# Altium project ELF 2 & ELF 2_Lite V1.3.PrjPcb (part 2 of 3)

## Sheet 06 MIPI.SchDoc
size A3; Revision: V1.2; SheetNumber: 6; SheetTotal: 11
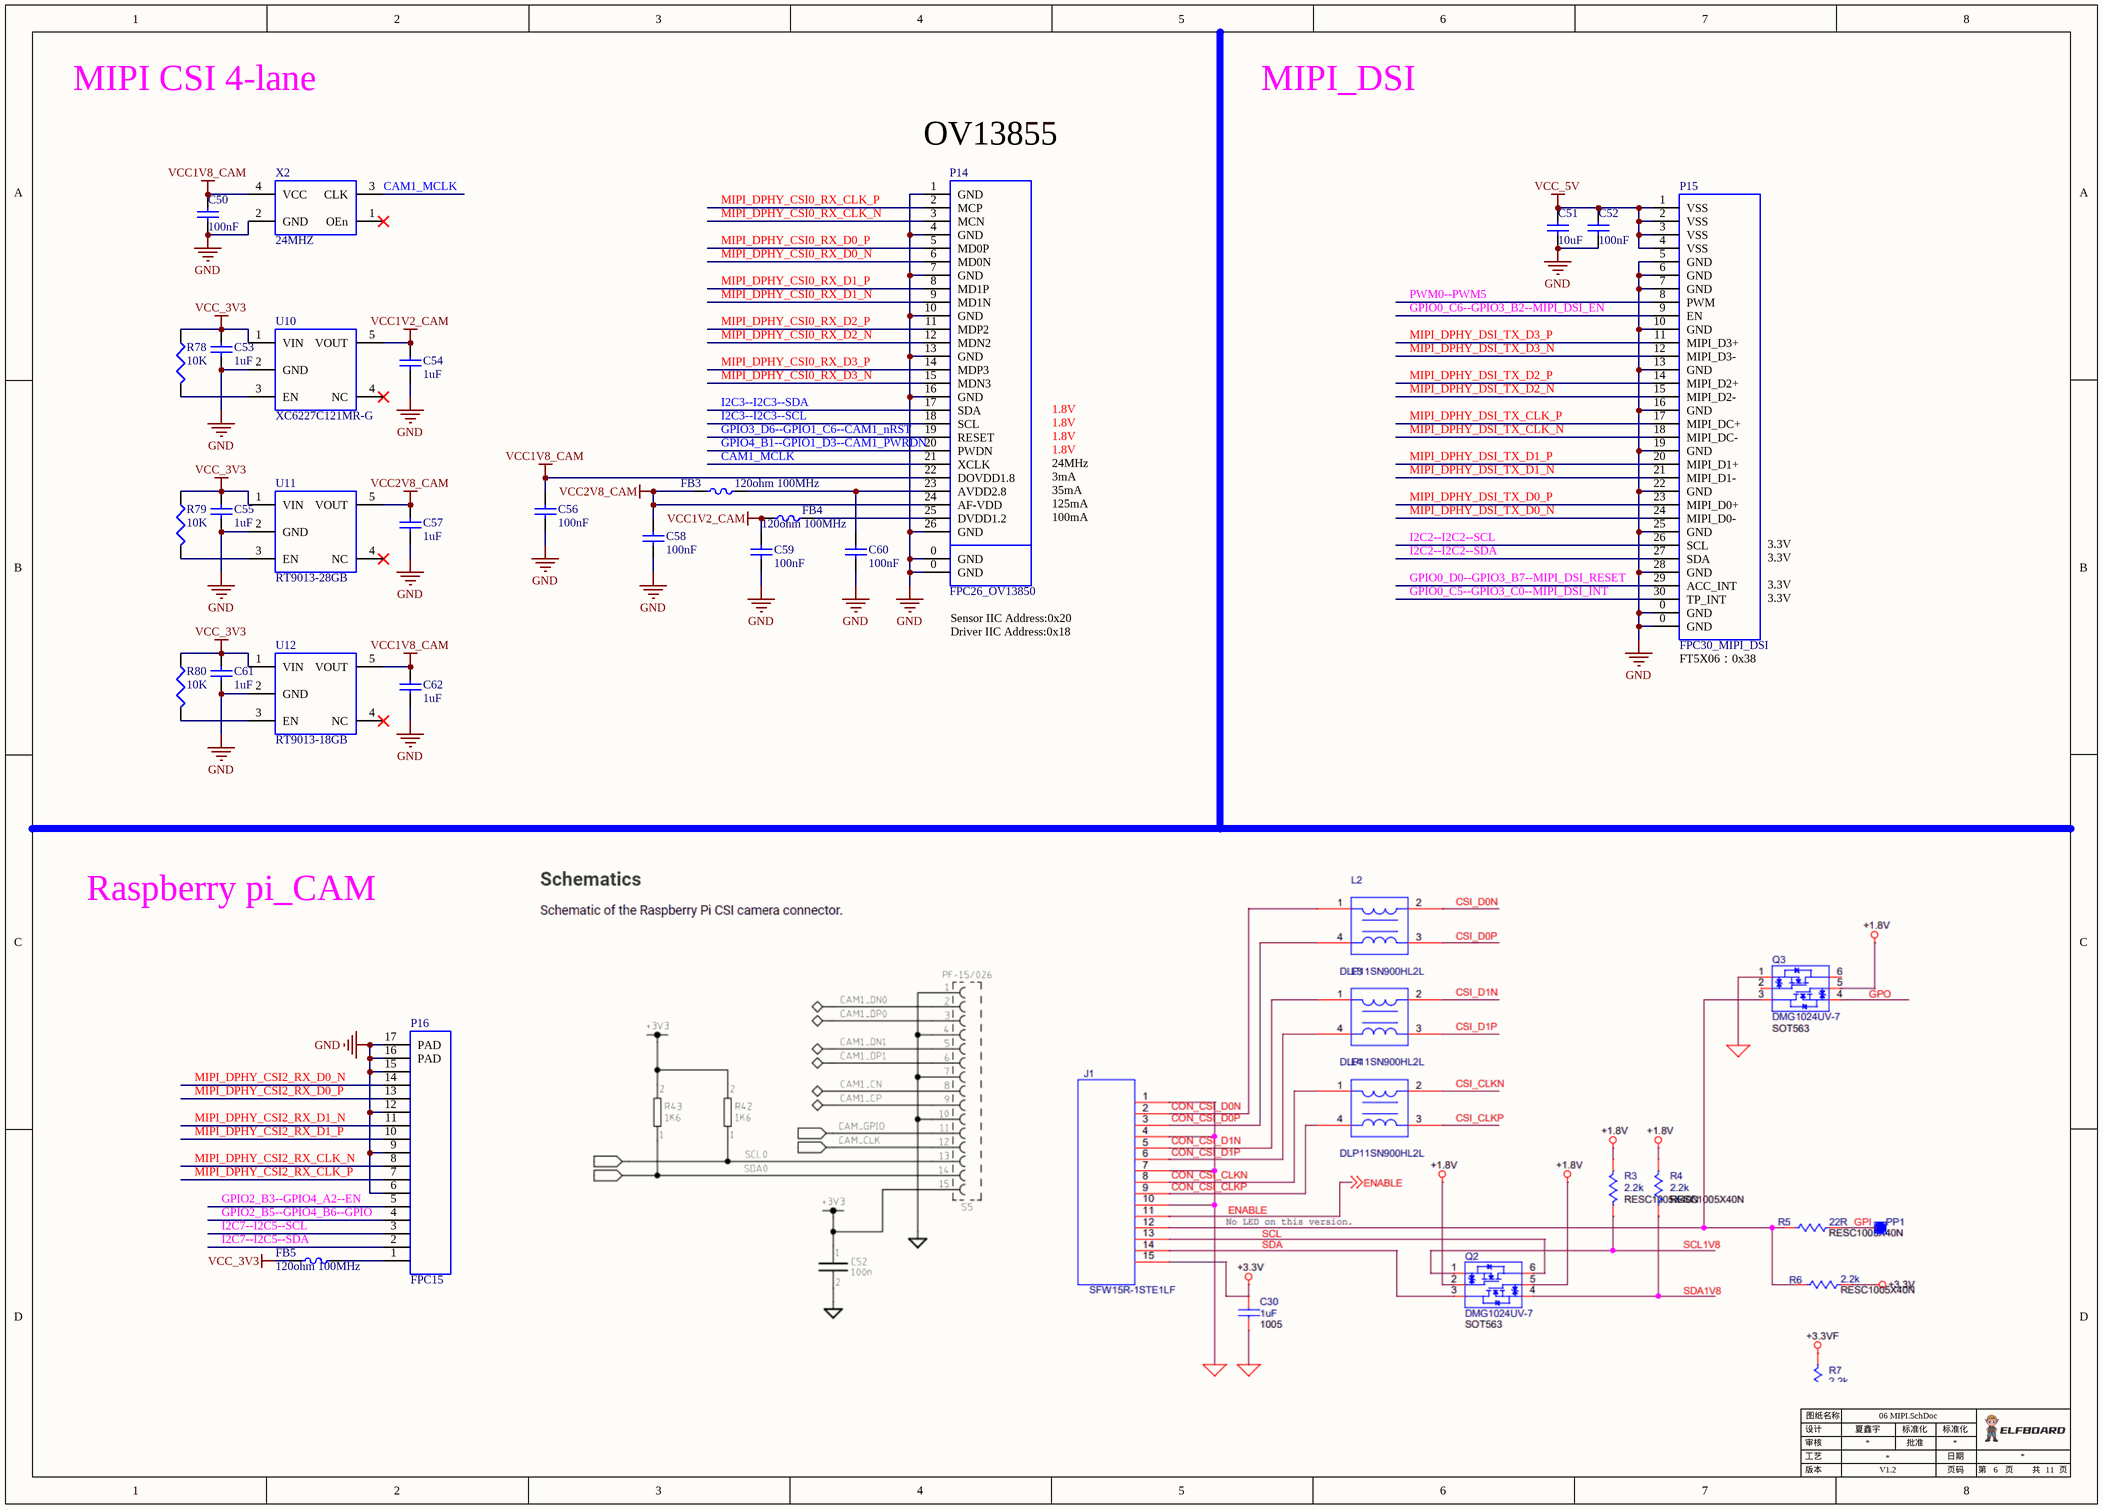
[diagram p8: 06 MIPI.SchDoc]

### Parts
C50  100nF  [0402C]
C51  10uF  [0603C]
C52  100nF  [0402C]
C53  1uF  [0402C]
C54  1uF  [0402C]
C55  1uF  [0402C]
C56  100nF  [0402C]
C57  1uF  [0402C]
C58  100nF  [0402C]
C59  100nF  [0402C]
C60  100nF  [0402C]
C61  1uF  [0402C]
C62  1uF  [0402C]
FB3  120ohm 100MHz  [0603L]
FB4  120ohm 100MHz  [0603L]
FB5  120ohm 100MHz  [0603L]
P14  FPC26_OV13850  [FPC26-a]
P15  FPC30_MIPI_DSI  [FPC30]
P16  FPC15  [FPC15-1-22_1X4_5-H5_4]
R78  10K  [0402R]
R79  10K  [0402R]
R80  10K  [0402R]
U10  XC6227C121MR-G  [SOT_235]
U11  RT9013-28GB  [SOT_235]
U12  RT9013-18GB  [SOT_235]
X2  24MHZ  [Crystals_3225]

### Nets
GND: C50.1 C51.1 C52.1 C53.1 C54.1 C55.1 C56.1 C57.1 C58.1 C59.1 C60.1 C61.1 C62.1 P14.0(GND) P14.1(GND) P14.4(GND) P14.7(GND) P14.10(GND) P14.13(GND) P14.16(GND) P14.26(GND) P15.0(GND) P15.5(GND) P15.6(GND) P15.7(GND) P15.10(GND) P15.13(GND) P15.16(GND) P15.19(GND) P15.22(GND) P15.25(GND) P15.28(GND) P16.6 P16.9 P16.12 P16.15 P16.16(PAD) P16.17(PAD) U10.2(GND) U11.2(GND) U12.2(GND) X2.2(GND)
VCC1V2_CAM: C54.2 C59.2 FB4.1 U10.5(VOUT)
VCC1V8_CAM: C50.2 C56.2 C62.2 P14.22(DOVDD1.8) U12.5(VOUT) X2.4(VCC)
VCC2V8_CAM: C57.2 C58.2 FB3.1 P14.24(AF-VDD) U11.5(VOUT)
VCC_3V3: C53.2 C55.2 C61.2 FB5.1 R78.1 R79.1 R80.1 U10.1(VIN) U11.1(VIN) U12.1(VIN)
VCC_5V: C51.2 C52.2 P15.1(VSS) P15.2(VSS) P15.3(VSS) P15.4(VSS)
CAM1_MCLK: P14.21(XCLK) X2.3(CLK)
GPIO0_C5--GPIO3_C0--MIPI_DSI_INT: P15.30(TP_INT)
GPIO0_C6--GPIO3_B2--MIPI_DSI_EN: P15.9(EN)
GPIO0_D0--GPIO3_B7--MIPI_DSI_RESET: P15.29(ACC_INT)
GPIO2_B3--GPIO4_A2--EN: P16.5
GPIO2_B5--GPIO4_B6--GPIO: P16.4
GPIO3_D6--GPIO1_C6--CAM1_nRST: P14.19(RESET)
GPIO4_B1--GPIO1_D3--CAM1_PWRDN: P14.20(PWDN)
I2C2--I2C2--SCL: P15.26(SCL)
I2C2--I2C2--SDA: P15.27(SDA)
I2C3--I2C3--SCL: P14.18(SCL)
I2C3--I2C3--SDA: P14.17(SDA)
I2C7--I2C5--SCL: P16.3
I2C7--I2C5--SDA: P16.2
MIPI_DPHY_CSI0_RX_CLK_N: P14.3(MCN)
MIPI_DPHY_CSI0_RX_CLK_P: P14.2(MCP)
MIPI_DPHY_CSI0_RX_D0_N: P14.6(MD0N)
MIPI_DPHY_CSI0_RX_D0_P: P14.5(MD0P)
MIPI_DPHY_CSI0_RX_D1_N: P14.9(MD1N)
MIPI_DPHY_CSI0_RX_D1_P: P14.8(MD1P)
MIPI_DPHY_CSI0_RX_D2_N: P14.12(MDN2)
MIPI_DPHY_CSI0_RX_D2_P: P14.11(MDP2)
MIPI_DPHY_CSI0_RX_D3_N: P14.15(MDN3)
MIPI_DPHY_CSI0_RX_D3_P: P14.14(MDP3)
MIPI_DPHY_CSI2_RX_CLK_N: P16.8
MIPI_DPHY_CSI2_RX_CLK_P: P16.7
MIPI_DPHY_CSI2_RX_D0_N: P16.14
MIPI_DPHY_CSI2_RX_D0_P: P16.13
MIPI_DPHY_CSI2_RX_D1_N: P16.11
MIPI_DPHY_CSI2_RX_D1_P: P16.10
MIPI_DPHY_DSI_TX_CLK_N: P15.18(MIPI_DC-)
MIPI_DPHY_DSI_TX_CLK_P: P15.17(MIPI_DC+)
MIPI_DPHY_DSI_TX_D0_N: P15.24(MIPI_D0-)
MIPI_DPHY_DSI_TX_D0_P: P15.23(MIPI_D0+)
MIPI_DPHY_DSI_TX_D1_N: P15.21(MIPI_D1-)
MIPI_DPHY_DSI_TX_D1_P: P15.20(MIPI_D1+)
MIPI_DPHY_DSI_TX_D2_N: P15.15(MIPI_D2-)
MIPI_DPHY_DSI_TX_D2_P: P15.14(MIPI_D2+)
MIPI_DPHY_DSI_TX_D3_N: P15.12(MIPI_D3-)
MIPI_DPHY_DSI_TX_D3_P: P15.11(MIPI_D3+)
PWM0--PWM5: P15.8(PWM)
NetC60_2: C60.2 FB3.2 P14.23(AVDD2.8)
NetFB4_2: FB4.2 P14.25(DVDD1.2)
NetFB5_2: FB5.2 P16.1
NetR78_2: R78.2 U10.3(EN)
NetR79_2: R79.2 U11.3(EN)
NetR80_2: R80.2 U12.3(EN)

Not connected (* = marked no-connect by the designer): U10 4(NC)*; U11 4(NC)*; U12 4(NC)*; X2 1(OEn)*

### Notes on the sheet
- MIPI CSI 4-lane
- MIPI_DSI
- (near P14) OV13855
- 1.8V
- 35mA
- 3mA
- 24MHz
- 125mA
- 100mA
- 3.3V
- (near P14) Sensor IIC Address:0x20
- Driver IIC Address:0x18
- (near P15) FT5X06：0x38
- Raspberry pi_CAM
- 设计
- 审核
- 工艺
- 图纸名称
- 夏鑫宇
- 批准
- 标准化
- 日期
- 版本
- 页码
- 第
- 页
- 共

### Library data of the parts
C50 C56 C58-C60 = 1110202001: as C31 on sheet 04 Debug&TF card&RTC; Published: 8-Jun-2000; LatestRevisionDate: 17-Jul-2002; LatestRevisionNote: Re-released for DXP Platform.; PackageReference: RAD-0.3; Publisher: Altium Limited; PackageDescription: Radial Cap, Thru-Hole; 2 Leads; 0.3 in Pin Spacing; Value: 100nF; 存货编码: 1110202001
C51 = 1110203037: 序号: 672; 存货名称: 贴装叠层陶瓷电容; 规格型号: 0603,10uF,10V,±20％,X5R; Published: 8-Jun-2000; LatestRevisionDate: 17-Jul-2002; LatestRevisionNote: Re-released for DXP Platform.; PackageReference: RAD-0.3; Publisher: Altium Limited; PackageDescription: Radial Cap, Thru-Hole; 2 Leads; 0.3 in Pin Spacing; Value: 10uF; 存货编码: 1110203037
C52 = 1110202039: as C11 on sheet 03 PWR; Published: 8-Jun-2000; LatestRevisionDate: 17-Jul-2002; LatestRevisionNote: Re-released for DXP Platform.; PackageReference: RAD-0.3; Publisher: Altium Limited; PackageDescription: Radial Cap, Thru-Hole; 2 Leads; 0.3 in Pin Spacing; Value: 100nF; 存货编码: 1110202039
C53-C55 C57 C61 C62 = 1110202021: as C5 on sheet 03 PWR; Published: 8-Jun-2000; LatestRevisionDate: 17-Jul-2002; LatestRevisionNote: Re-released for DXP Platform.; PackageReference: RAD-0.3; Publisher: Altium Limited; PackageDescription: Radial Cap, Thru-Hole; 2 Leads; 0.3 in Pin Spacing; Value: 1uF; 存货编码: 1110202021
FB3-FB5 = 1110304009: 序号: 998; 存货名称: 磁珠; 规格型号: 0603,120 Ohm@100MHz,2A,BLM18PG121SN1; 描述栏信息: 村田; 主计量单位名称: 只; 安全库存: 148; 旧编码: 010301062; 旧规格型号: 0603 120Ohm 100MHz 2A BLM18PG121SN1 村田; VALUE: 120ohm 100MHz; 存货编码: 1110304009
P14 = FPC26_OV13850: 010401124; 序号: 51; 存货编码: 1120103021; 存货名称: FPC座; 规格型号: 26P,0.5mm,下接翻盖; 安全库存: 1831.00; Value: FPC26_OV13850; 旧编码: 010401124
P15 = FPC30_MIPI_DSI: 010401065; 序号: 53; 存货编码: 1120103013; 存货名称: FPC座; 规格型号: 30P,0.5mm,下接翻盖; 安全库存: 390.00; Value: FPC30_MIPI_DSI; 旧编码: 010401065
P16 = 1120103051: 存货名称: FPC座; 规格型号: 15P,1.0mm,抽屉式,贴片立式; 描述: 艾诺康; 禁用: 否; Value: FPC15; 存货编码: 1120103051
R78-R80 = 1110102007: 序号: 17; 存货名称: 贴装电阻; 规格型号: 0402,10K,±5％; Value: 10K; 存货编码: 1110102007
U10 = 1110404122: 序号: 1340; 存货名称: 电源; 规格型号: XC6227C121MR-G,SOT_25; 禁用: 否; 近三年购买频次: 近三年购买频次.8; Value: XC6227C121MR-G; 存货编码: 1110404122; 最近一次购买记录: 2024/12/19; 料号建立日期: 2019/11/23
U11 = 1110404096: 序号: 2092; 存货名称: 集成电路; 安全库存: 2574; 旧编码: 010504174; 存货编码: 1110404096; 规格型号: RT9013-28GB; Value: RT9013-28GB; 旧规格型号: RT9013-28GB
U12 = 1110404097: as U1 on sheet 03 PWR; Value: RT9013-18GB; 存货编码: 1110404097
X2 = 1110601007: 序号: 3406; 存货名称: 贴装晶振; 规格型号: 有源,24MHZ,4P,3.2*2.5mm,3.3V,±20ppm; Value: 24MHZ; 存货编码: 1110601007

## Sheet 07 HDMI.SchDoc
size A3; Revision: V1.2; SheetNumber: 7; SheetTotal: 11
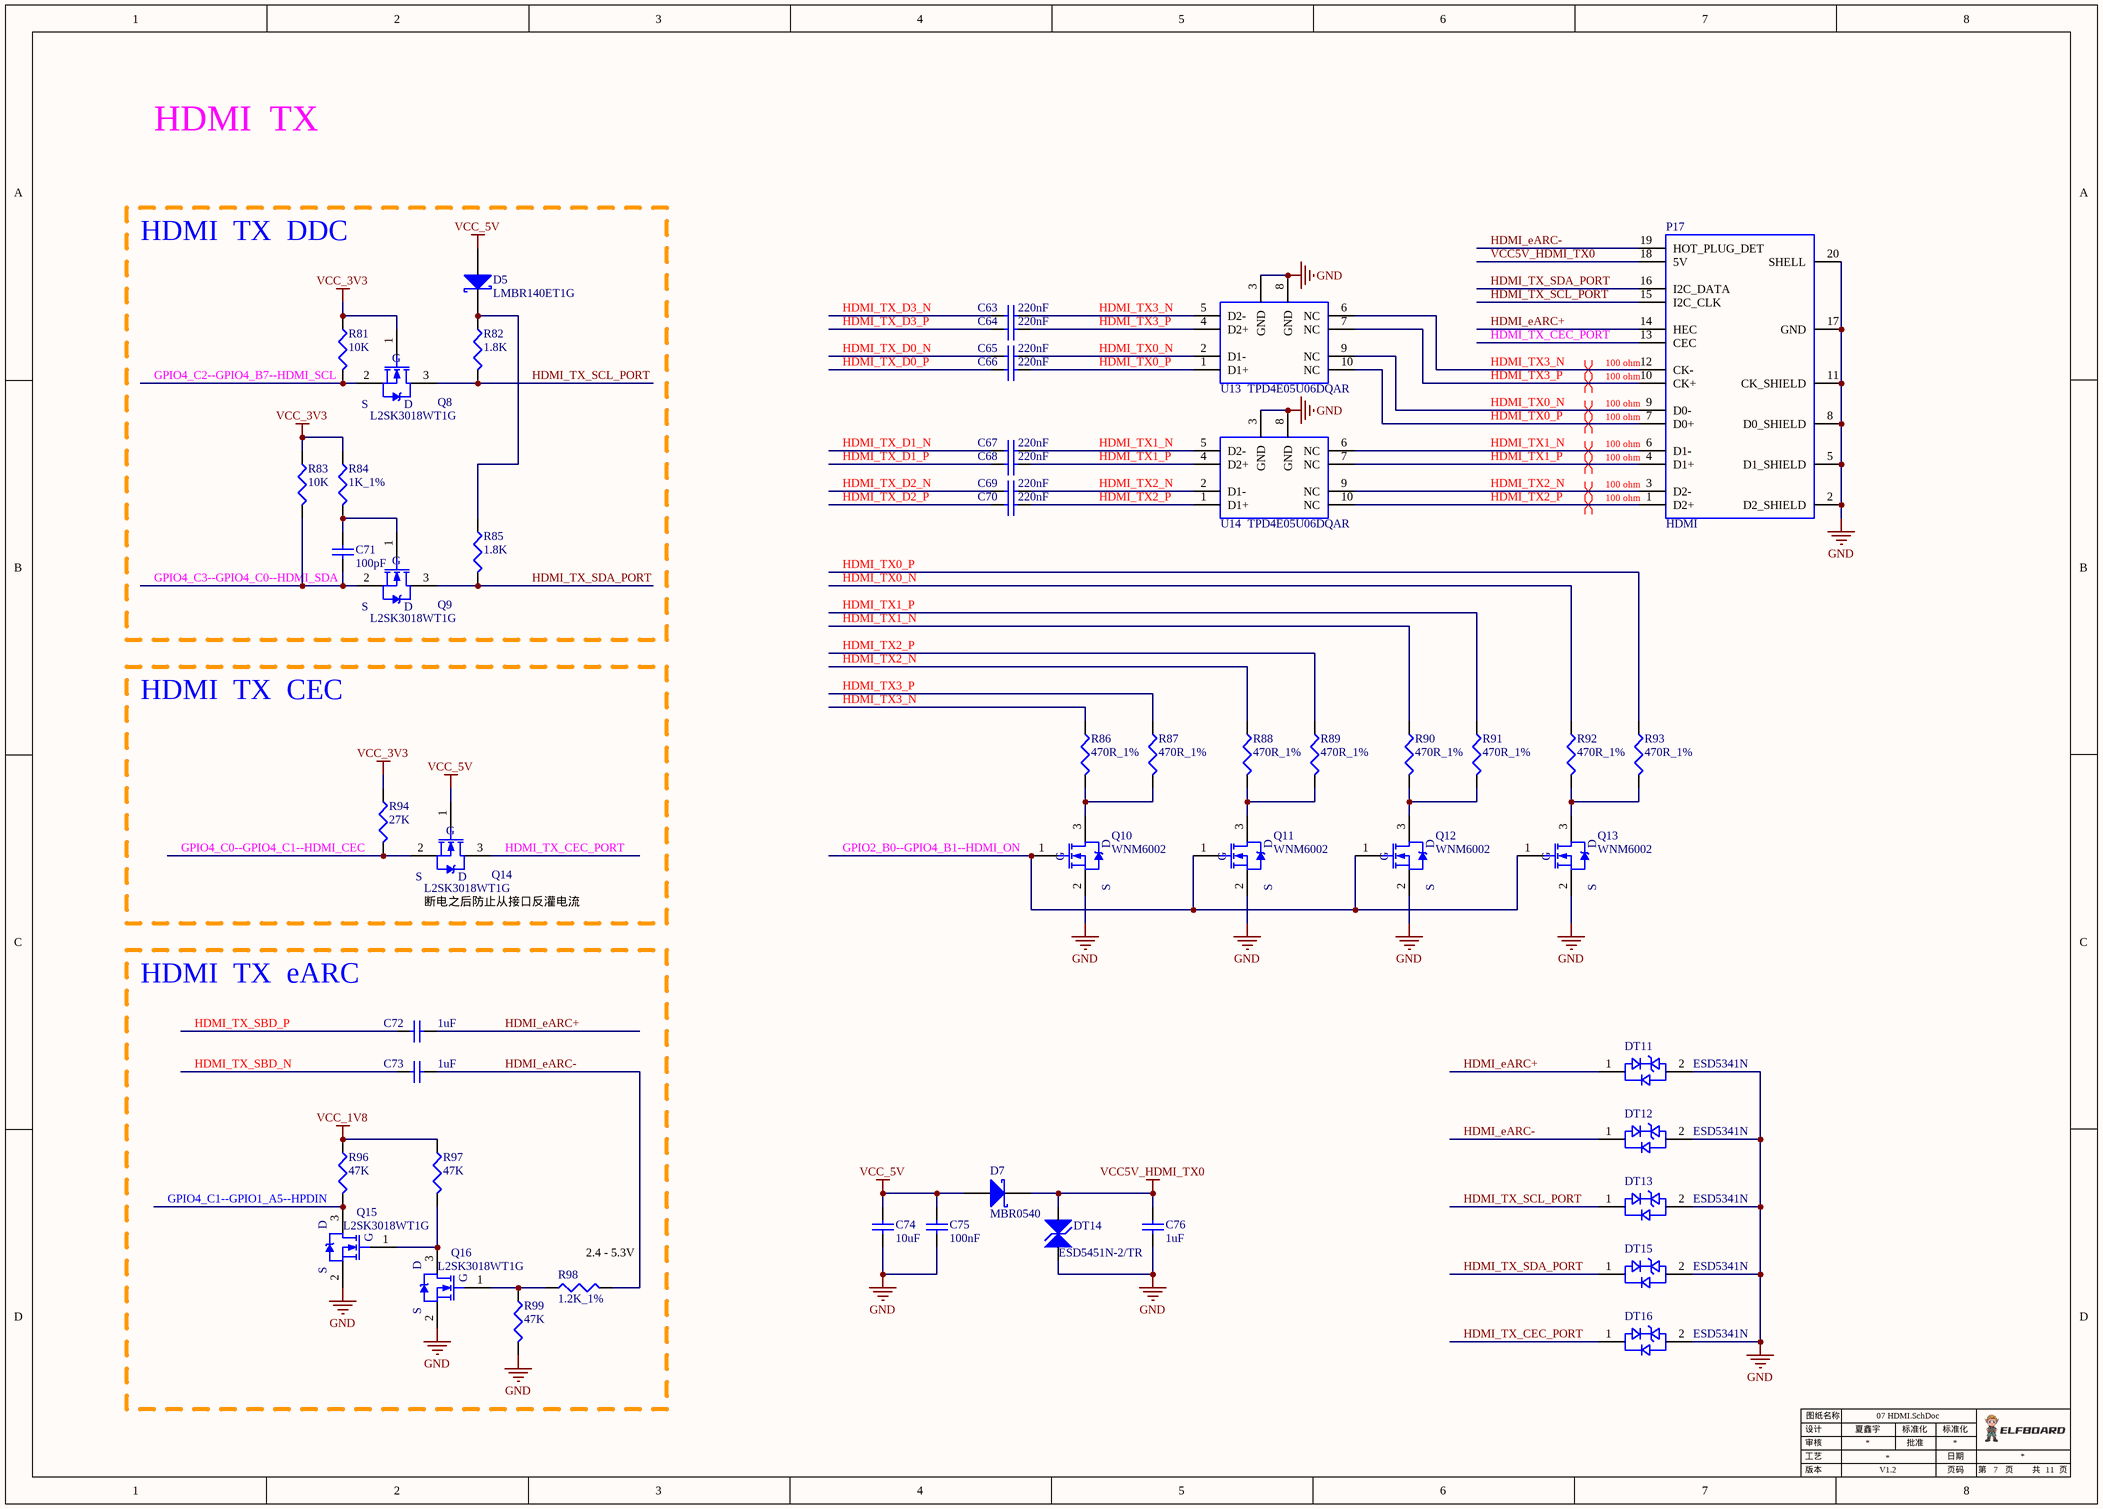
[diagram p9: 07 HDMI.SchDoc]

### Parts
C63  220nF  [0201C]
C64  220nF  [0201C]
C65  220nF  [0201C]
C66  220nF  [0201C]
C67  220nF  [0201C]
C68  220nF  [0201C]
C69  220nF  [0201C]
C70  220nF  [0201C]
C71  100pF  [0402C]
C72  1uF  [0201C]
C73  1uF  [0201C]
C74  10uF  [0603C]
C75  100nF  [0603C]
C76  1uF  [0402C]
D5  LMBR140ET1G  [SOD_323]
D7  MBR0540  [SOD_123]
DT11  ESD5341N  [0402TVS-ESD5341N]
DT12  ESD5341N  [0402TVS-ESD5341N]
DT13  ESD5341N  [0402TVS-ESD5341N]
DT14  ESD5451N-2/TR  [0402TVS]
DT15  ESD5341N  [0402TVS-ESD5341N]
DT16  ESD5341N  [0402TVS-ESD5341N]
P17  HDMI  [HDMI]
Q8  L2SK3018WT1G  [SOT323]
Q9  L2SK3018WT1G  [SOT323]
Q10  WNM6002  [SOT_323]
Q11  WNM6002  [SOT_323]
Q12  WNM6002  [SOT_323]
Q13  WNM6002  [SOT_323]
Q14  L2SK3018WT1G  [SOT323]
Q15  L2SK3018WT1G  [SOT323]
Q16  L2SK3018WT1G  [SOT323]
R81  10K  [0402R]
R82  1.8K  [0402R]
R83  10K  [0402R]
R84  1K_1%  [0402R]
R85  1.8K  [0402R]
R86  470R_1%  [0201R]
R87  470R_1%  [0201R]
R88  470R_1%  [0201R]
R89  470R_1%  [0201R]
R90  470R_1%  [0201R]
R91  470R_1%  [0201R]
R92  470R_1%  [0201R]
R93  470R_1%  [0201R]
R94  27K  [0402R]
R96  47K  [0402R]
R97  47K  [0402R]
R98  1.2K_1%  [0402R]
R99  47K  [0402R]
U13  TPD4E05U06DQAR  [USON-10]
U14  TPD4E05U06DQAR  [USON-10]

### Nets
GND: C74.1 C75.1 C76.1 DT11.2 DT12.2 DT13.2 DT14.1 DT15.2 DT16.2 P17.2(D2_SHIELD) P17.5(D1_SHIELD) P17.8(D0_SHIELD) P17.11(CK_SHIELD) P17.17(GND) P17.20(SHELL) Q10.2(S) Q11.2(S) Q12.2(S) Q13.2(S) Q15.2(S) Q16.2(S) R99.2 U13.3(GND) U13.8(GND) U14.3(GND) U14.8(GND)
VCC5V_HDMI_TX0: C76.2 D7.2(K) DT14.2 P17.18(5V)
VCC_1V8: R96.1 R97.1
VCC_3V3: Q8.1(G) R81.1 R83.1 R84.1 R94.1
VCC_5V: C74.2 C75.2 D5.1(A) D7.1(A) Q14.1(G)
GPIO2_B0--GPIO4_B1--HDMI_ON: Q10.1(G) Q11.1(G) Q12.1(G) Q13.1(G)
GPIO4_C0--GPIO4_C1--HDMI_CEC: Q14.2(S) R94.2
GPIO4_C1--GPIO1_A5--HPDIN: Q15.3(D) R96.2
GPIO4_C2--GPIO4_B7--HDMI_SCL: Q8.2(S) R81.2
GPIO4_C3--GPIO4_C0--HDMI_SDA: C71.1 Q9.2(S) R83.2
HDMI_eARC+: C72.2 DT11.1 P17.14(HEC)
HDMI_eARC-: C73.2 DT12.1 P17.19(HOT_PLUG_DET) R98.2
HDMI_TX0_N: C65.2 P17.9(D0-) R92.1 U13.2(D1-) U13.9(NC)
HDMI_TX0_P: C66.2 P17.7(D0+) R93.1 U13.1(D1+) U13.10(NC)
HDMI_TX1_N: C67.2 P17.6(D1-) R90.1 U14.5(D2-) U14.6(NC)
HDMI_TX1_P: C68.2 P17.4(D1+) R91.1 U14.4(D2+) U14.7(NC)
HDMI_TX2_N: C69.2 P17.3(D2-) R88.1 U14.2(D1-) U14.9(NC)
HDMI_TX2_P: C70.2 P17.1(D2+) R89.1 U14.1(D1+) U14.10(NC)
HDMI_TX3_N: C63.2 P17.12(CK-) R86.1 U13.5(D2-) U13.6(NC)
HDMI_TX3_P: C64.2 P17.10(CK+) R87.1 U13.4(D2+) U13.7(NC)
HDMI_TX_CEC_PORT: DT16.1 P17.13(CEC) Q14.3(D)
HDMI_TX_D0_N: C65.1
HDMI_TX_D0_P: C66.1
HDMI_TX_D1_N: C67.1
HDMI_TX_D1_P: C68.1
HDMI_TX_D2_N: C69.1
HDMI_TX_D2_P: C70.1
HDMI_TX_D3_N: C63.1
HDMI_TX_D3_P: C64.1
HDMI_TX_SBD_N: C73.1
HDMI_TX_SBD_P: C72.1
HDMI_TX_SCL_PORT: DT13.1 P17.15(I2C_CLK) Q8.3(D) R82.2
HDMI_TX_SDA_PORT: DT15.1 P17.16(I2C_DATA) Q9.3(D) R85.2
NetC71_2: C71.2 Q9.1(G) R84.2
NetD5_2: D5.2(K) R82.1 R85.1
NetQ10_3: Q10.3(D) R86.2 R87.2
NetQ11_3: Q11.3(D) R88.2 R89.2
NetQ12_3: Q12.3(D) R90.2 R91.2
NetQ13_3: Q13.3(D) R92.2 R93.2
NetQ15_1: Q15.1(G) Q16.3(D) R97.2
NetQ16_1: Q16.1(G) R98.1 R99.1

### Layout directives
differential pair; differential pair class 100 ohm: HDMI_TX0_N, HDMI_TX0_P, HDMI_TX1_N, HDMI_TX1_P, HDMI_TX2_N, HDMI_TX2_P, HDMI_TX3_N, HDMI_TX3_P

### Notes on the sheet
- HDMI  TX
- HDMI  TX  DDC
- HDMI  TX  CEC
- (near Q14) 断电之后防止从接口反灌电流
- HDMI  TX  eARC
- (near R98) 2.4 - 5.3V
- 设计
- 审核
- 工艺
- 图纸名称
- 夏鑫宇
- 批准
- 标准化
- 日期
- 版本
- 页码
- 第
- 页
- 共

### Library data of the parts
C63-C70 = 1110201001: 序号: 928; 存货名称: 贴装叠层陶瓷电容; 规格型号: 0201,220nF,6.3V,±20％,X5R; Published: 8-Jun-2000; LatestRevisionDate: 17-Jul-2002; LatestRevisionNote: Re-released for DXP Platform.; PackageReference: RAD-0.3; Publisher: Altium Limited; PackageDescription: Radial Cap, Thru-Hole; 2 Leads; 0.3 in Pin Spacing; Value: 220nF; 存货编码: 1110201001
C71 = 1110202016: 序号: 587; 存货名称: 贴装叠层陶瓷电容; 规格型号: 0402,100pF,50V,±5％,NPO; Published: 8-Jun-2000; LatestRevisionDate: 17-Jul-2002; LatestRevisionNote: Re-released for DXP Platform.; PackageReference: RAD-0.3; Publisher: Altium Limited; PackageDescription: Radial Cap, Thru-Hole; 2 Leads; 0.3 in Pin Spacing; Value: 100pF; 存货编码: 1110202016
C72 C73 = 1110201015: 存货名称: 贴装叠层陶瓷电容; 规格型号: 0201,1uF,10V,±20％,X5R; Published: 8-Jun-2000; LatestRevisionDate: 17-Jul-2002; LatestRevisionNote: Re-released for DXP Platform.; PackageReference: RAD-0.3; Publisher: Altium Limited; PackageDescription: Radial Cap, Thru-Hole; 2 Leads; 0.3 in Pin Spacing; Value: 1uF; 存货编码: 1110201015
C74 = 1110203058: 序号: 707; 存货名称: 贴装叠层陶瓷电容; 规格型号: 0603,10uF,10V,±10％,X5R; 禁用状态: 否; Published: 8-Jun-2000; LatestRevisionDate: 17-Jul-2002; LatestRevisionNote: Re-released for DXP Platform.; PackageReference: RAD-0.3; Publisher: Altium Limited; PackageDescription: Radial Cap, Thru-Hole; 2 Leads; 0.3 in Pin Spacing; Value: 10uF; 存货编码: 1110203058
C75 = 1110203001: 序号: 628; 存货名称: 贴装叠层陶瓷电容; 规格型号: 0603,100nF,50V,±10％,X7R; 禁用状态: 否; Published: 8-Jun-2000; LatestRevisionDate: 17-Jul-2002; LatestRevisionNote: Re-released for DXP Platform.; PackageReference: RAD-0.3; Publisher: Altium Limited; PackageDescription: Radial Cap, Thru-Hole; 2 Leads; 0.3 in Pin Spacing; Value: 100nF; 存货编码: 1110203001
C76 = 1110202021: as C5 on sheet 03 PWR; Published: 8-Jun-2000; LatestRevisionDate: 17-Jul-2002; LatestRevisionNote: Re-released for DXP Platform.; PackageReference: RAD-0.3; Publisher: Altium Limited; PackageDescription: Radial Cap, Thru-Hole; 2 Leads; 0.3 in Pin Spacing; Value: 1uF; 存货编码: 1110202021
D5 = 1110501064: 存货名称: 肖特基二极管; 规格型号: LMBR140ET1G,SOD323; Published: 8-Jun-2000; LatestRevisionDate: 17-Jul-2002; LatestRevisionNote: Re-released for DXP Platform.; PackageReference: SMB; Publisher: Altium Limited; PackageDescription: DO-214-AA/SMB; 2 C-Bend Leads; Body 5.3 x 3.6 mm, inc. leads (LxW); Code_JEDEC: DO-214-AA; 存货编码: 1110501064; Value: LMBR140ET1G
D7 = 1110501001: 序号: 2480; 存货名称: 肖特基二极管; 规格型号: MBR0540,SOD123; Published: 8-Jun-2000; LatestRevisionDate: 17-Jul-2002; LatestRevisionNote: Re-released for DXP Platform.; PackageReference: SMB; Publisher: Altium Limited; PackageDescription: DO-214-AA/SMB; 2 C-Bend Leads; Body 5.3 x 3.6 mm, inc. leads (LxW); Code_JEDEC: DO-214-AA; 存货编码: 1110501001; Value: MBR0540
DT11-DT13 DT15 DT16 = 1110503052: 序号: 4824; 存货名称: TVS管; 规格型号: ESD5341N-2/TR,0402TVS; value: ESD5341N-2/TR; 禁用状态: 否; 存货编码: 1110503052
DT14 = 1110503036: 存货名称: TVS管; 规格型号: ESD5451N-2/TR,DFN1006-2L; 禁用状态: 否; Value: ESD5451N-2/TR; 存货编码: 1110503036
P17 = 1120202041: 序号: 2494; 存货名称: 插装HDMI座; 规格型号: A型; 描述: FCI生产编号:10029449,001RLF,与1120202030通用; 禁用状态: 否; 存货编码: 1120202041; value: HDMI
Q8 Q9 Q14-Q16 = 1110505029: Note: Pin 2 is electrically connected to pin 4.; 序号: 4061; 存货名称: 场效应管; 规格型号: L2SK3018WT1G,SOT-323; 描述: 替代1110505016; 禁用状态: 否; Published: 8-Jun-2000; LatestRevisionDate: 17-Jul-2002; LatestRevisionNote: Re-released for DXP Platform.; DatasheetVersion: PD-9.814; PackageVersion: Feb-1997; PackageReference: TO-220AB; Publisher: Altium Limited; PackageDescription: TO, Thru-Hole, Vertical, Heatsink Mounted; 3 In-Line Leads; Pitch 2.54 mm; VALUE: L2SK3018WT1G; 存货编码: 1110505029
Q10-Q13 = 1110505033: Note: Pin 2 is electrically connected to pin 4.; 序号: 4825; 存货名称: 场效应管; 规格型号: WNM6002,SOT_323,N沟道; 禁用状态: 否; Published: 8-Jun-2000; LatestRevisionDate: 17-Jul-2002; LatestRevisionNote: Re-released for DXP Platform.; DatasheetVersion: PD-9.814; PackageVersion: Feb-1997; PackageReference: TO-220AB; Publisher: Altium Limited; PackageDescription: TO, Thru-Hole, Vertical, Heatsink Mounted; 3 In-Line Leads; Pitch 2.54 mm; VALUE: WNM6002; 存货编码: 1110505033
R81 R83 = 1110102007: 序号: 17; 存货名称: 贴装电阻; 规格型号: 0402,10K,±5％; Value: 10K; 存货编码: 1110102007
R82 R85 = 1110102185: 存货名称: 贴装电阻; 规格型号: 0402,1.8K,±5％; 描述栏信息: 厚声; Value: 1.8K; 存货编码: 1110102185
R84 = 1110102011: 序号: 21; 存货名称: 贴装电阻; 规格型号: 0402,1K,±1％; Value: 1K_1%; 存货编码: 1110102011
R86-R93 = 1110101007: 存货名称: 贴装电阻; 规格型号: 0201,470Ω,±1％; Value: 470R_1%; 存货编码: 1110101007
R94 = 1110102085: 序号: 119; 存货名称: 贴装电阻; 规格型号: 0402,27K,±5％; Value: 27K; 存货编码: 1110102085
R96 R97 R99 = 1110102040: 序号: 53; 存货名称: 贴装电阻; 规格型号: 0402,47K,±5％; Value: 47K; 存货编码: 1110102040
R98 = 1110102012: 序号: 22; 存货名称: 贴装电阻; 规格型号: 0402,1.2K,±1％; Value: 1.2K_1%; 存货编码: 1110102012
U13 U14 = 1110503037: 存货名称: TVS管; 规格型号: TPD4E05U06DQAR,USON; Value: TPD4E05U06DQAR; 存货编码: 1110503037

## Sheet 08 TypeC USB DP.SchDoc
size A3; Revision: V1.2; SheetNumber: 8; SheetTotal: 11
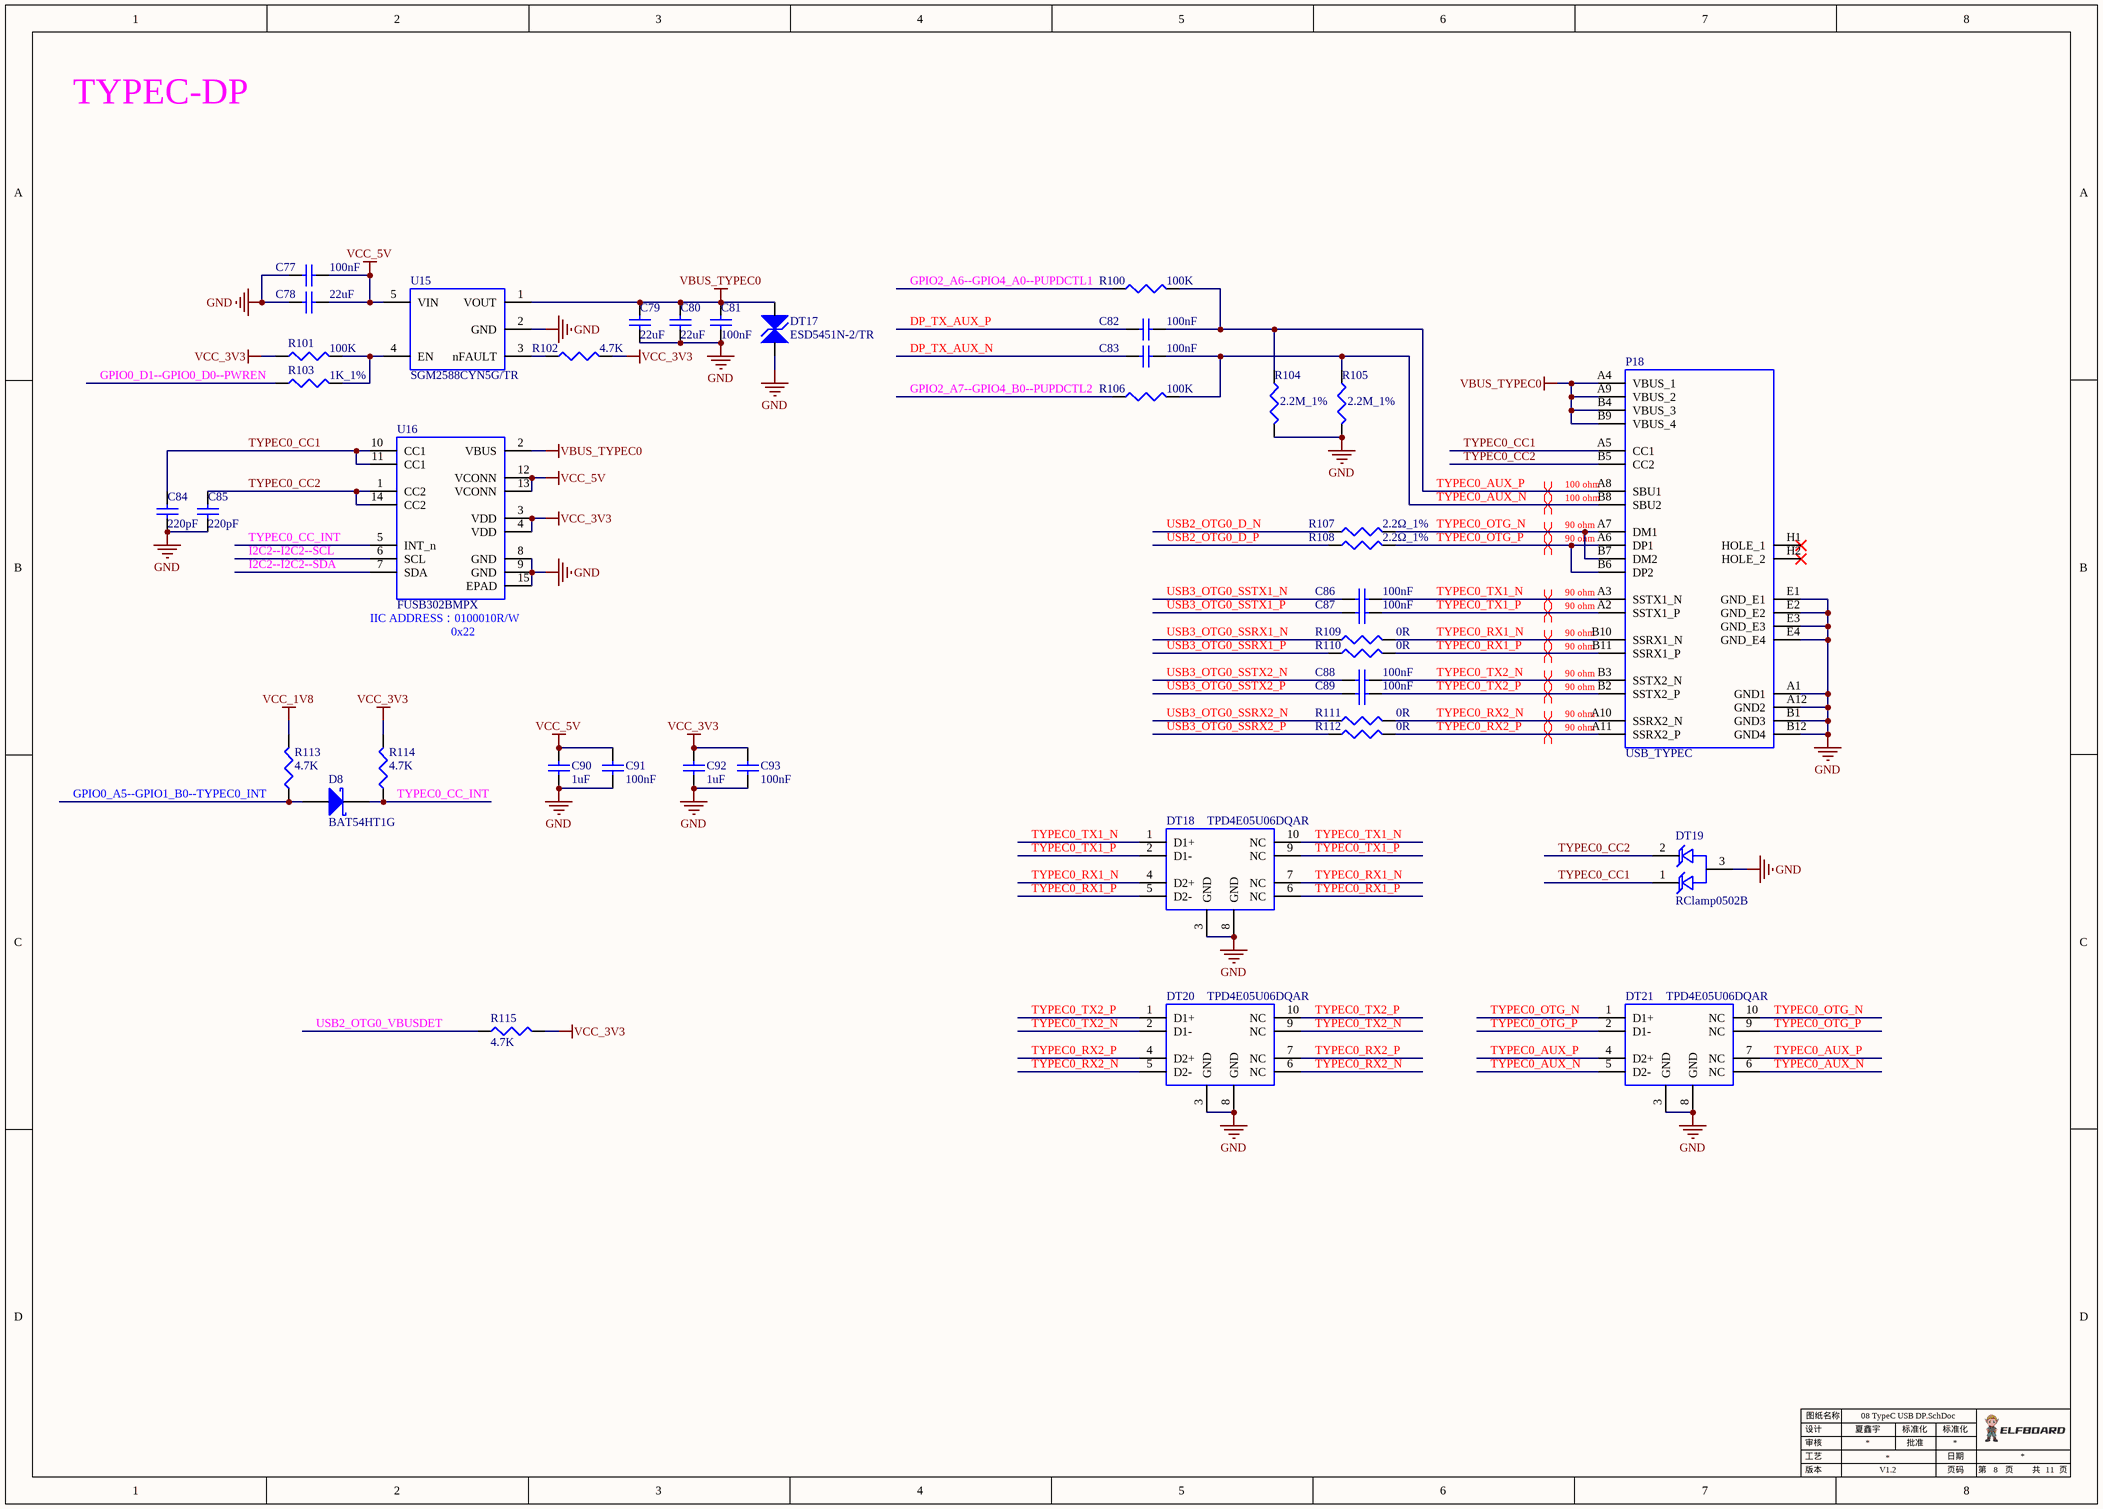
[diagram p10: 08 TypeC USB DP.SchDoc]

### Parts
C77  100nF  [0402C]
C78  22uF  [0805C]
C79  22uF  [0805C]
C80  22uF  [0805C]
C81  100nF  [0402C]
C82  100nF  [0201C]
C83  100nF  [0201C]
C84  220pF  [0402C]
C85  220pF  [0402C]
C86  100nF  [0201C]
C87  100nF  [0201C]
C88  100nF  [0201C]
C89  100nF  [0201C]
C90  1uF  [0402C]
C91  100nF  [0402C]
C92  1uF  [0402C]
C93  100nF  [0402C]
D8  BAT54HT1G  [SOD_323]
DT17  ESD5451N-2/TR  [0402TVS]
DT18  TPD4E05U06DQAR  [USON-10]
DT19  RClamp0502B  [SOT_523]
DT20  TPD4E05U06DQAR  [USON-10]
DT21  TPD4E05U06DQAR  [USON-10]
P18  USB_TYPEC  [USB_TYPEC_SMT]
R100  100K  [0402R]
R101  100K  [0402R]
R102  4.7K  [0402R]
R103  1K_1%  [0402R]
R104  2.2M_1%  [0201R]
R105  2.2M_1%  [0201R]
R106  100K  [0402R]
R107  2.2Ω_1%  [0402R]
R108  2.2Ω_1%  [0402R]
R109  0R  [0201R]
R110  0R  [0201R]
R111  0R  [0201R]
R112  0R  [0201R]
R113  4.7K  [0402R]
R114  4.7K  [0402R]
R115  4.7K  [0402R]
U15  SGM2588CYN5G/TR  [SOT_235]
U16  FUSB302BMPX  [WQFN14_0.5_2.5x2.5]

### Nets
GND: C77.2 C78.2 C79.1 C80.1 C81.1 C84.2 C85.2 C90.1 C91.1 C92.1 C93.1 DT17.1 DT18.3(GND) DT18.8(GND) DT19.3 DT20.3(GND) DT20.8(GND) DT21.3(GND) DT21.8(GND) P18.A1(GND1) P18.A12(GND2) P18.B1(GND3) P18.B12(GND4) P18.E1(GND_E1) P18.E2(GND_E2) P18.E3(GND_E3) P18.E4(GND_E4) R104.2 R105.2 U15.2(GND) U16.8(GND) U16.9(GND) U16.15(EPAD)
VBUS_TYPEC0: C79.2 C80.2 C81.2 DT17.2 P18.A4(VBUS_1) P18.A9(VBUS_2) P18.B4(VBUS_3) P18.B9(VBUS_4) U15.1(VOUT) U16.2(VBUS)
VCC_1V8: R113.2
VCC_3V3: C92.2 C93.2 R101.1 R102.2 R114.2 R115.2 U16.3(VDD) U16.4(VDD)
VCC_5V: C77.1 C78.1 C90.2 C91.2 U15.5(VIN) U16.12(VCONN) U16.13(VCONN)
DP_TX_AUX_N: C83.1
DP_TX_AUX_P: C82.1
GPIO0_A5--GPIO1_B0--TYPEC0_INT: D8.1(A) R113.1
GPIO0_D1--GPIO0_D0--PWREN: R103.1
GPIO2_A6--GPIO4_A0--PUPDCTL1: R100.1
GPIO2_A7--GPIO4_B0--PUPDCTL2: R106.1
I2C2--I2C2--SCL: U16.6(SCL)
I2C2--I2C2--SDA: U16.7(SDA)
TYPEC0_AUX_N: C83.2 DT21.5(D2-) DT21.6(NC) P18.B8(SBU2) R105.1 R106.2
TYPEC0_AUX_P: C82.2 DT21.4(D2+) DT21.7(NC) P18.A8(SBU1) R100.2 R104.1
TYPEC0_CC1: C84.1 DT19.1 P18.A5(CC1) U16.10(CC1) U16.11(CC1)
TYPEC0_CC2: C85.1 DT19.2 P18.B5(CC2) U16.1(CC2) U16.14(CC2)
TYPEC0_CC_INT: D8.2(K) R114.1 U16.5(INT_n)
TYPEC0_OTG_N: DT21.1(D1+) DT21.10(NC) P18.A7(DM1) P18.B7(DM2) R107.2
TYPEC0_OTG_P: DT21.2(D1-) DT21.9(NC) P18.A6(DP1) P18.B6(DP2) R108.2
TYPEC0_RX1_N: DT18.4(D2+) DT18.7(NC) P18.B10(SSRX1_N) R109.2
TYPEC0_RX1_P: DT18.5(D2-) DT18.6(NC) P18.B11(SSRX1_P) R110.2
TYPEC0_RX2_N: DT20.5(D2-) DT20.6(NC) P18.A10(SSRX2_N) R111.2
TYPEC0_RX2_P: DT20.4(D2+) DT20.7(NC) P18.A11(SSRX2_P) R112.2
TYPEC0_TX1_N: C86.2 DT18.1(D1+) DT18.10(NC) P18.A3(SSTX1_N)
TYPEC0_TX1_P: C87.2 DT18.2(D1-) DT18.9(NC) P18.A2(SSTX1_P)
TYPEC0_TX2_N: C88.2 DT20.2(D1-) DT20.9(NC) P18.B3(SSTX2_N)
TYPEC0_TX2_P: C89.2 DT20.1(D1+) DT20.10(NC) P18.B2(SSTX2_P)
USB2_OTG0_D_N: R107.1
USB2_OTG0_D_P: R108.1
USB2_OTG0_VBUSDET: R115.1
USB3_OTG0_SSRX1_N: R109.1
USB3_OTG0_SSRX1_P: R110.1
USB3_OTG0_SSRX2_N: R111.1
USB3_OTG0_SSRX2_P: R112.1
USB3_OTG0_SSTX1_N: C86.1
USB3_OTG0_SSTX1_P: C87.1
USB3_OTG0_SSTX2_N: C88.1
USB3_OTG0_SSTX2_P: C89.1
NetR101_2: R101.2 R103.2 U15.4(EN)
NetR102_1: R102.1 U15.3(nFAULT)

Not connected (* = marked no-connect by the designer): P18 H1(HOLE_1)* H2(HOLE_2)*

### Layout directives
differential pair; differential pair class 90 ohm: TYPEC0_OTG_N, TYPEC0_OTG_P, TYPEC0_RX1_N, TYPEC0_RX1_P, TYPEC0_RX2_N, TYPEC0_RX2_P, TYPEC0_TX1_N, TYPEC0_TX1_P, TYPEC0_TX2_N, TYPEC0_TX2_P
differential pair; differential pair class 100 ohm: TYPEC0_AUX_N, TYPEC0_AUX_P

### Notes on the sheet
- TYPEC-DP
- (near U16) IIC ADDRESS：0100010R/W
- (near U16) 0x22
- 设计
- 审核
- 工艺
- 图纸名称
- 夏鑫宇
- 批准
- 标准化
- 日期
- 版本
- 页码
- 第
- 页
- 共

### Library data of the parts
C77 C81 C91 C93 = 1110202039: as C11 on sheet 03 PWR; Published: 8-Jun-2000; LatestRevisionDate: 17-Jul-2002; LatestRevisionNote: Re-released for DXP Platform.; PackageReference: RAD-0.3; Publisher: Altium Limited; PackageDescription: Radial Cap, Thru-Hole; 2 Leads; 0.3 in Pin Spacing; Value: 100nF; 存货编码: 1110202039
C78-C80 = 1110204014: 序号: 751; 存货名称: 贴装叠层陶瓷电容; 规格型号: 0805,22uF,25V,±20％,X5R; Published: 8-Jun-2000; LatestRevisionDate: 17-Jul-2002; LatestRevisionNote: Re-released for DXP Platform.; PackageReference: RAD-0.3; Publisher: Altium Limited; PackageDescription: Radial Cap, Thru-Hole; 2 Leads; 0.3 in Pin Spacing; Value: 22uF; 存货编码: 1110204014
C82 C83 C86-C89 = 1110201009: 存货名称: 贴装叠层陶瓷电容; 规格型号: 0201,100nF,25V,±10％,X5R; Published: 8-Jun-2000; LatestRevisionDate: 17-Jul-2002; LatestRevisionNote: Re-released for DXP Platform.; PackageReference: RAD-0.3; Publisher: Altium Limited; PackageDescription: Radial Cap, Thru-Hole; 2 Leads; 0.3 in Pin Spacing; Value: 100nF; 存货编码: 1110201009
C84 C85 = 1110202017: 序号: 588; 存货名称: 贴装叠层陶瓷电容; 规格型号: 0402,220pF,50V,±10％,X7R; Published: 8-Jun-2000; LatestRevisionDate: 17-Jul-2002; LatestRevisionNote: Re-released for DXP Platform.; PackageReference: RAD-0.3; Publisher: Altium Limited; PackageDescription: Radial Cap, Thru-Hole; 2 Leads; 0.3 in Pin Spacing; Value: 220pF; 存货编码: 1110202017
C90 C92 = 1110202021: as C5 on sheet 03 PWR; Published: 8-Jun-2000; LatestRevisionDate: 17-Jul-2002; LatestRevisionNote: Re-released for DXP Platform.; PackageReference: RAD-0.3; Publisher: Altium Limited; PackageDescription: Radial Cap, Thru-Hole; 2 Leads; 0.3 in Pin Spacing; Value: 1uF; 存货编码: 1110202021
D8 = 1110501028: 序号: 2525; 存货名称: 肖特基二极管; 规格型号: BAT54HT1G,SOD323; Published: 8-Jun-2000; LatestRevisionDate: 17-Jul-2002; LatestRevisionNote: Re-released for DXP Platform.; PackageReference: SMB; Publisher: Altium Limited; PackageDescription: DO-214-AA/SMB; 2 C-Bend Leads; Body 5.3 x 3.6 mm, inc. leads (LxW); Code_JEDEC: DO-214-AA; 存货编码: 1110501028; Value: BAT54HT1G
DT17 = 1110503036: as DT14 on sheet 07 HDMI; Value: ESD5451N-2/TR; 存货编码: 1110503036
DT18 DT20 DT21 = 1110503037: 存货名称: TVS管; 规格型号: TPD4E05U06DQAR,USON; Value: TPD4E05U06DQAR; 存货编码: 1110503037
DT19 = 1110503016: 序号: 2598; 存货名称: TVS管; 规格型号: RCLAMP0502B,SOT-523; Value: RClamp0502B; 存货编码: 1110503016
P18 = 1120102089: 存货名称: 贴装USB座; 规格型号: USB3.0,Type-C,母座,单层,横卧,脚长2mm,雾面,-25~+80℃ TYPEC-507DSW-ACP24F; Value: TYPEC-507DSW-ACP24F; 存货编码: 1120102089
R100 R101 R106 = 1110102004: 序号: 14; 存货名称: 贴装电阻; 规格型号: 0402,100K,±5％; Value: 100K; 存货编码: 1110102004
R102 R113-R115 = 1110102003: 序号: 12; 存货名称: 贴装电阻; 规格型号: 0402,4.7K,±5％; Value: 4.7K; 存货编码: 1110102003
R103 = 1110102011: 序号: 21; 存货名称: 贴装电阻; 规格型号: 0402,1K,±1％; Value: 1K_1%; 存货编码: 1110102011
R104 R105 = 1110101020: 存货名称: 贴装电阻; 规格型号: 0201,2.2M,±1％; Value: 2.2M_1%; 存货编码: 1110101020
R107 R108 = 1110102176: 序号: 196; 存货名称: 贴装电阻; 规格型号: 0402,2.2Ω,±1％; 禁用状态: 否; Value: 2.2Ω_1%; 存货编码: 1110102176
R109-R112 = 1110101001: 序号: 556; 存货名称: 贴装电阻; 规格型号: 0201,0Ω,±5%; Value: 0R; 存货编码: 1110101001
U15 = 1110404183: 序号: 4794; 存货名称: 电源; 规格型号: SGM2588CYN5G/TR,SOT-23-5; 禁用: 否; 近三年购买频次: 近三年购买频次.19; Value: SGM2588CYN5G/TR; 存货编码: 1110404183; 最近一次购买记录: 2025/2/8; 料号建立日期: 2022/10/14
U16 = 1110405272: 存货名称: 常规IC; 规格型号: FUSB302BMPX,WQFN-14; Value: FUSB302BMPX; 存货编码: 1110405272

## Sheet 09 Audio.SchDoc
size A4; Revision: V1.2; SheetNumber: 9; SheetTotal: 11
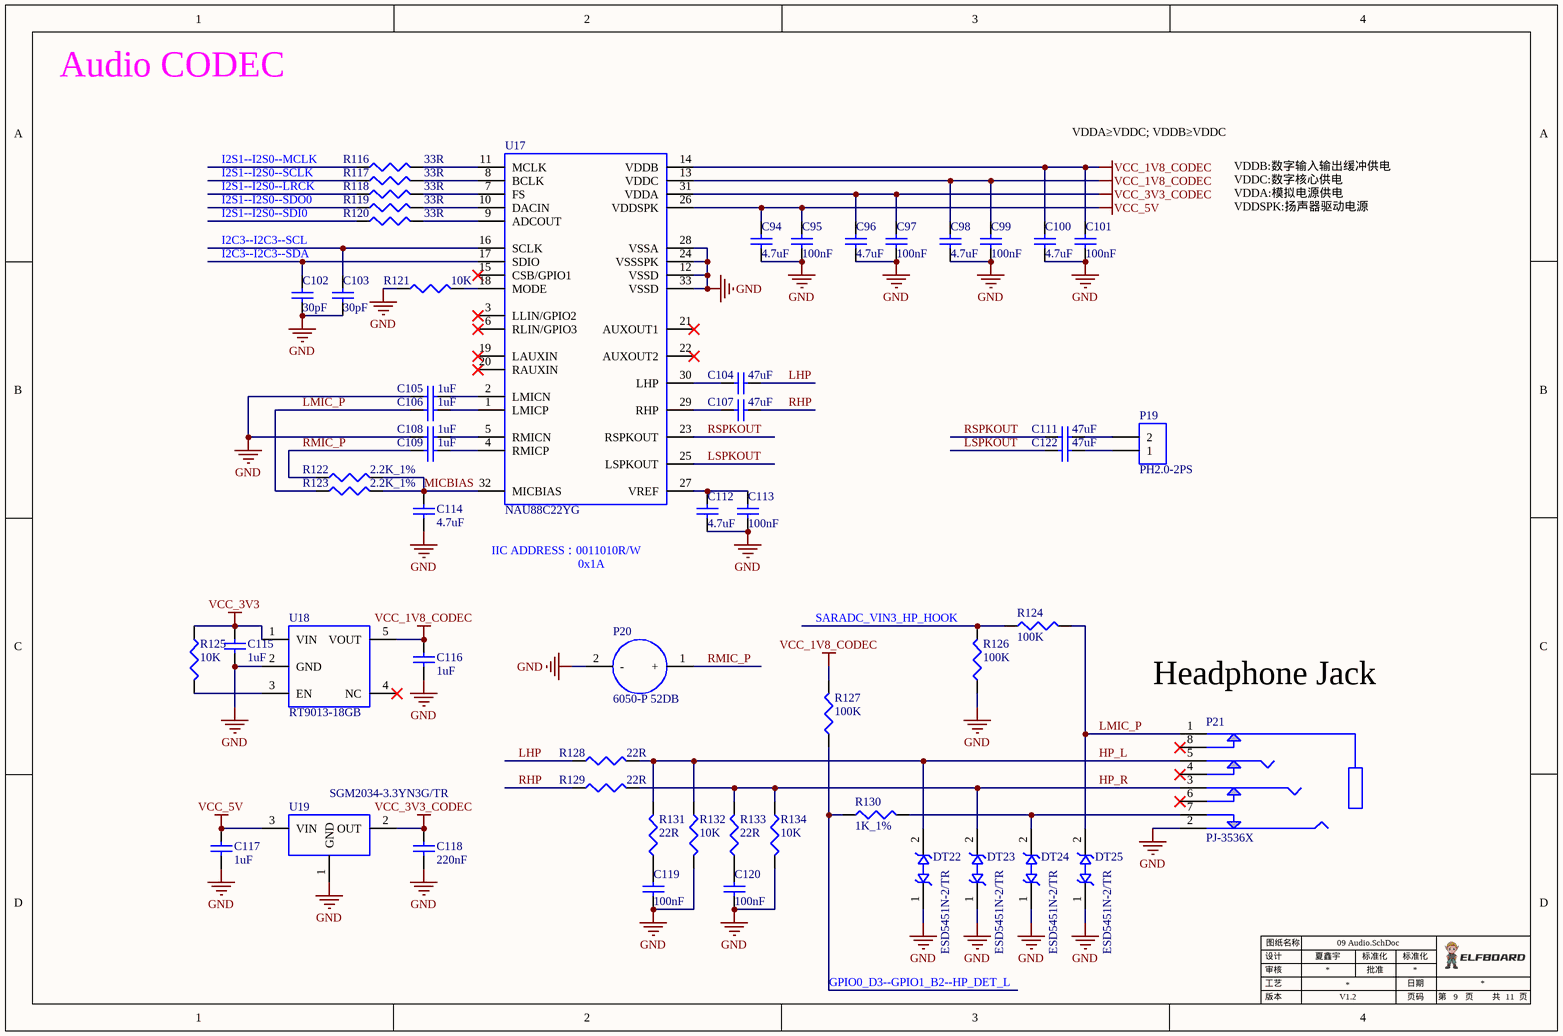
[diagram p11: 09 Audio.SchDoc]

### Parts
C94  4.7uF  [0402C]
C95  100nF  [0402C]
C96  4.7uF  [0402C]
C97  100nF  [0402C]
C98  4.7uF  [0402C]
C99  100nF  [0402C]
C100  4.7uF  [0402C]
C101  100nF  [0402C]
C102  30pF  [0402C]
C103  30pF  [0402C]
C104  47uF  [0805C]
C105  1uF  [0402C]
C106  1uF  [0402C]
C107  47uF  [0805C]
C108  1uF  [0402C]
C109  1uF  [0402C]
C111  47uF  [0805C]
C112  4.7uF  [0402C]
C113  100nF  [0402C]
C114  4.7uF  [0402C]
C115  1uF  [0402C]
C116  1uF  [0402C]
C117  1uF  [0402C]
C118  220nF  [0402C]
C119  100nF  [0402C]
C120  100nF  [0402C]
C122  47uF  [0805C]
DT22  ESD5451N-2/TR  [0402TVS]
DT23  ESD5451N-2/TR  [0402TVS]
DT24  ESD5451N-2/TR  [0402TVS]
DT25  ESD5451N-2/TR  [0402TVS]
P19  PH2.0-2PS  [PH2.0_2P_V]
P20  6050-P 52DB  [MIC 2*5]
P21  PJ-3536X  [PJ3930-8P]
R116  33R  [0402R]
R117  33R  [0402R]
R118  33R  [0402R]
R119  33R  [0402R]
R120  33R  [0402R]
R121  10K  [0402R]
R122  2.2K_1%  [0402R]
R123  2.2K_1%  [0402R]
R124  100K  [0402R]
R125  10K  [0402R]
R126  100K  [0402R]
R127  100K  [0402R]
R128  22R  [0402R]
R129  22R  [0402R]
R130  1K_1%  [0402R]
R131  22R  [0402R]
R132  10K  [0402R]
R133  22R  [0402R]
R134  10K  [0402R]
U17  NAU88C22YG  [QFN32P_0.5BSC_5*5_H_3..65*3.65]
U18  RT9013-18GB  [SOT_235]
U19  SGM2034-3.3YN3G/TR  [SOT_233_N]

### Nets
GND: C94.1 C95.1 C96.1 C97.1 C98.1 C99.1 C100.1 C101.1 C102.1 C103.1 C105.1 C108.1 C112.1 C113.1 C114.1 C115.1 C116.1 C117.1 C118.1 C119.1 C120.1 DT22.1 DT23.1 DT24.1 DT25.1 P20.2(-) P21.2 R121.1 R126.1 R132.2 R134.2 U17.12(VSSD) U17.24(VSSSPK) U17.28(VSSA) U17.33(VSSD) U18.2(GND) U19.1(GND)
VCC_1V8_CODEC: C98.2 C99.2 C100.2 C101.2 C116.2 R127.2 U17.13(VDDC) U17.14(VDDB) U18.5(VOUT)
VCC_3V3: C115.2 R125.1 U18.1(VIN)
VCC_3V3_CODEC: C96.2 C97.2 C118.2 U17.31(VDDA) U19.2(OUT)
VCC_5V: C94.2 C95.2 C117.2 U17.26(VDDSPK) U19.3(VIN)
GPIO0_D3--GPIO1_B2--HP_DET_L: R127.1 R130.1
HP_L: DT22.2 P21.5 R128.2 R131.2 R132.1
HP_R: DT23.2 P21.3 R129.2 R133.2 R134.1
I2C3--I2C3--SCL: C103.2 U17.16(SCLK)
I2C3--I2C3--SDA: C102.2 U17.17(SDIO)
I2S1--I2S0--LRCK: R118.1
I2S1--I2S0--MCLK: R116.1
I2S1--I2S0--SCLK: R117.1
I2S1--I2S0--SDI0: R120.1
I2S1--I2S0--SDO0: R119.1
LHP: C104.2 R128.1
LMIC_P: C106.1 DT25.2 P21.1 R123.1 R124.2
LSPKOUT: C122.1 U17.25(LSPKOUT)
MICBIAS: C114.2 R122.2 R123.2 U17.32(MICBIAS)
RHP: C107.2 R129.1
RMIC_P: C109.1 P20.1(+) R122.1
RSPKOUT: C111.1 U17.23(RSPKOUT)
SARADC_VIN3_HP_HOOK: R124.1 R126.2
NetC104_1: C104.1 U17.30(LHP)
NetC105_2: C105.2 U17.2(LMICN)
NetC106_2: C106.2 U17.1(LMICP)
NetC107_1: C107.1 U17.29(RHP)
NetC108_2: C108.2 U17.5(RMICN)
NetC109_2: C109.2 U17.4(RMICP)
NetC111_2: C111.2 P19.2
NetC112_2: C112.2 C113.2 U17.27(VREF)
NetC119_2: C119.2 R131.1
NetC120_2: C120.2 R133.1
NetC122_2: C122.2 P19.1
NetDT24_2: DT24.2 P21.7 R130.2
NetR116_2: R116.2 U17.11(MCLK)
NetR117_2: R117.2 U17.8(BCLK)
NetR118_2: R118.2 U17.7(FS)
NetR119_2: R119.2 U17.10(DACIN)
NetR120_2: R120.2 U17.9(ADCOUT)
NetR121_2: R121.2 U17.18(MODE)
NetR125_2: R125.2 U18.3(EN)

Not connected (* = marked no-connect by the designer): P21 4* 6* 8*; U17 3(LLIN/GPIO2)* 6(RLIN/GPIO3)* 15(CSB/GPIO1)* 19(LAUXIN)* 20(RAUXIN)* 21(AUXOUT1)* 22(AUXOUT2)*; U18 4(NC)*

### Notes on the sheet
- Audio CODEC
- VDDA≥VDDC; VDDB≥VDDC
- VDDB:数字输入输出缓冲供电
- VDDC:数字核心供电
- VDDA:模拟电源供电
- VDDSPK:扬声器驱动电源
- IIC ADDRESS：0011010R/W
- 0x1A
- (near P21) Headphone Jack
- 设计
- 审核
- 工艺
- 图纸名称
- 夏鑫宇
- 批准
- 标准化
- 日期
- 版本
- 页码
- 第
- 页
- 共

### Library data of the parts
C94 C96 C98 C100 C112 C114 = 1110202032: 序号: 616; 存货名称: 贴装叠层陶瓷电容; 规格型号: 0402,4.7uF,10V,±10％,X5R; Published: 8-Jun-2000; LatestRevisionDate: 17-Jul-2002; LatestRevisionNote: Re-released for DXP Platform.; PackageReference: RAD-0.3; Publisher: Altium Limited; PackageDescription: Radial Cap, Thru-Hole; 2 Leads; 0.3 in Pin Spacing; Value: 4.7uF; 存货编码: 1110202032
C95 C97 C99 C101 C113 C119 C120 = 1110202039: 序号: 626; 存货名称: 贴装叠层陶瓷电容; 规格型号: 0402,100nF,25V,±10％,X5R; Published: 8-Jun-2000; LatestRevisionDate: 17-Jul-2002; LatestRevisionNote: Re-released for DXP Platform.; PackageReference: RAD-0.3; Publisher: Altium Limited; PackageDescription: Radial Cap, Thru-Hole; 2 Leads; 0.3 in Pin Spacing; Value: 100nF; 存货编码: 1110202039
C102 C103 = 1110202045: 存货名称: 贴装叠层陶瓷电容; 规格型号: 0402,30pF,50V,±5%,NPO; Published: 8-Jun-2000; LatestRevisionDate: 17-Jul-2002; LatestRevisionNote: Re-released for DXP Platform.; PackageReference: RAD-0.3; Publisher: Altium Limited; PackageDescription: Radial Cap, Thru-Hole; 2 Leads; 0.3 in Pin Spacing; Value: 30pF; 存货编码: 1110202045
C104 C107 C111 C122 = 1110204008: 序号: 711; 存货名称: 贴装叠层陶瓷电容; 规格型号: 0805,47uF,6.3V,±20％,X5R; 禁用: #REF!; 近三年购买频次（更新至2023/12/7）: 近三年购买频次,41; Published: 8-Jun-2000; LatestRevisionDate: 17-Jul-2002; LatestRevisionNote: Re-released for DXP Platform.; PackageReference: RAD-0.3; Publisher: Altium Limited; PackageDescription: Radial Cap, Thru-Hole; 2 Leads; 0.3 in Pin Spacing; Value: 47uF; 存货编码: 1110204008; 最近一次购买记录(更新至20231207）: 2023/11/15; 料号建立日期: 2019/7/2
C105 C106 C108 C109 C115-C117 = 1110202021: 序号: 600; 存货名称: 贴装叠层陶瓷电容; 规格型号: 0402,1uF,16V,±10％,X5R; Published: 8-Jun-2000; LatestRevisionDate: 17-Jul-2002; LatestRevisionNote: Re-released for DXP Platform.; PackageReference: RAD-0.3; Publisher: Altium Limited; PackageDescription: Radial Cap, Thru-Hole; 2 Leads; 0.3 in Pin Spacing; Value: 1uF; 存货编码: 1110202021
C118 = 1110202042: 存货名称: 贴装叠层陶瓷电容; 规格型号: 0402,220nF,25V,±10％,X5R; Published: 8-Jun-2000; LatestRevisionDate: 17-Jul-2002; LatestRevisionNote: Re-released for DXP Platform.; PackageReference: RAD-0.3; Publisher: Altium Limited; PackageDescription: Radial Cap, Thru-Hole; 2 Leads; 0.3 in Pin Spacing; Value: 220nF; 存货编码: 1110202042
DT22-DT25 = 1110503036: 存货名称: TVS管; 规格型号: ESD5451N-2/TR,DFN1006-2L; Value: ESD5451N-2/TR; 存货编码: 1110503036
P19 = 1120201007: 序号: 1261; 存货名称: 插装连接器; 规格型号: PH,公头,2P,2.0mm,S; LatestRevisionDate: 17-Jul-2002; LatestRevisionNote: Re-released for DXP Platform.; Publisher: Altium Limited; Value: PH2.0-2PS; 存货编码: 1120201007
P20 = 1120202094: 序号: 4063; 存货名称: 话筒; 规格型号: 6050-P 52DB 带引脚; 描述栏信息: 咪头; 存货编码: 1120202094; Value: 6050-P 52DB
P21 = 1120102026: 3.5mm音频4级耳机插座，SMT贴片黑色; 序号: 2191; 存货名称: 贴装音频座; 规格型号: PJ3930-8P,3.5mm,4级; 禁用状态: 否; Value: PJ-3536X; 存货编码: 1120102026
R116-R120 = 1110102027: 序号: 38; 存货名称: 贴装电阻; 规格型号: 0402,33Ω,±5％; Value: 33R; 存货编码: 1110102027
R121 R125 R132 R134 = 1110102007: 序号: 17; 存货名称: 贴装电阻; 规格型号: 0402,10K,±5％; Value: 10K; 存货编码: 1110102007
R122 R123 = 1110102038: 序号: 51; 存货名称: 贴装电阻; 规格型号: 0402,2.2K,±1％; Value: 2.2K_1%; 存货编码: 1110102038
R124 R126 R127 = 1110102004: 序号: 14; 存货名称: 贴装电阻; 规格型号: 0402,100K,±5％; Value: 100K; 存货编码: 1110102004
R128 R129 R131 R133 = 1110102028: 序号: 41; 存货名称: 贴装电阻; 规格型号: 0402,22Ω,±5％; Value: 22R; 存货编码: 1110102028
R130 = 1110102011: 序号: 21; 存货名称: 贴装电阻; 规格型号: 0402,1K,±1％; Value: 1K_1%; 存货编码: 1110102011
U17 = 1110405394: 存货名称: 常规IC; 规格型号: NAU88C22YG,QFN32; value: NAU88C22YG; 存货编码: 1110405394
U18 = 1110404097: 序号: 2093; 存货名称: 电源; 规格型号: RT9013-18GB,SOT-23-5; Value: RT9013-18GB; 存货编码: 1110404097
U19 = 1110404126: 存货名称: 电源; 规格型号: SGM2034-3.3YN3G/TR,SOT-23-3; 描述栏信息: 替代1110404068，备件为1110404151; 存货编码: 1110404126; Value: SGM2034-3.3YN3G/TR

## Sheet 10 USB2.0 HUB&PCIe.SchDoc
size A3; Revision: V1.2; SheetNumber: 10; SheetTotal: 11
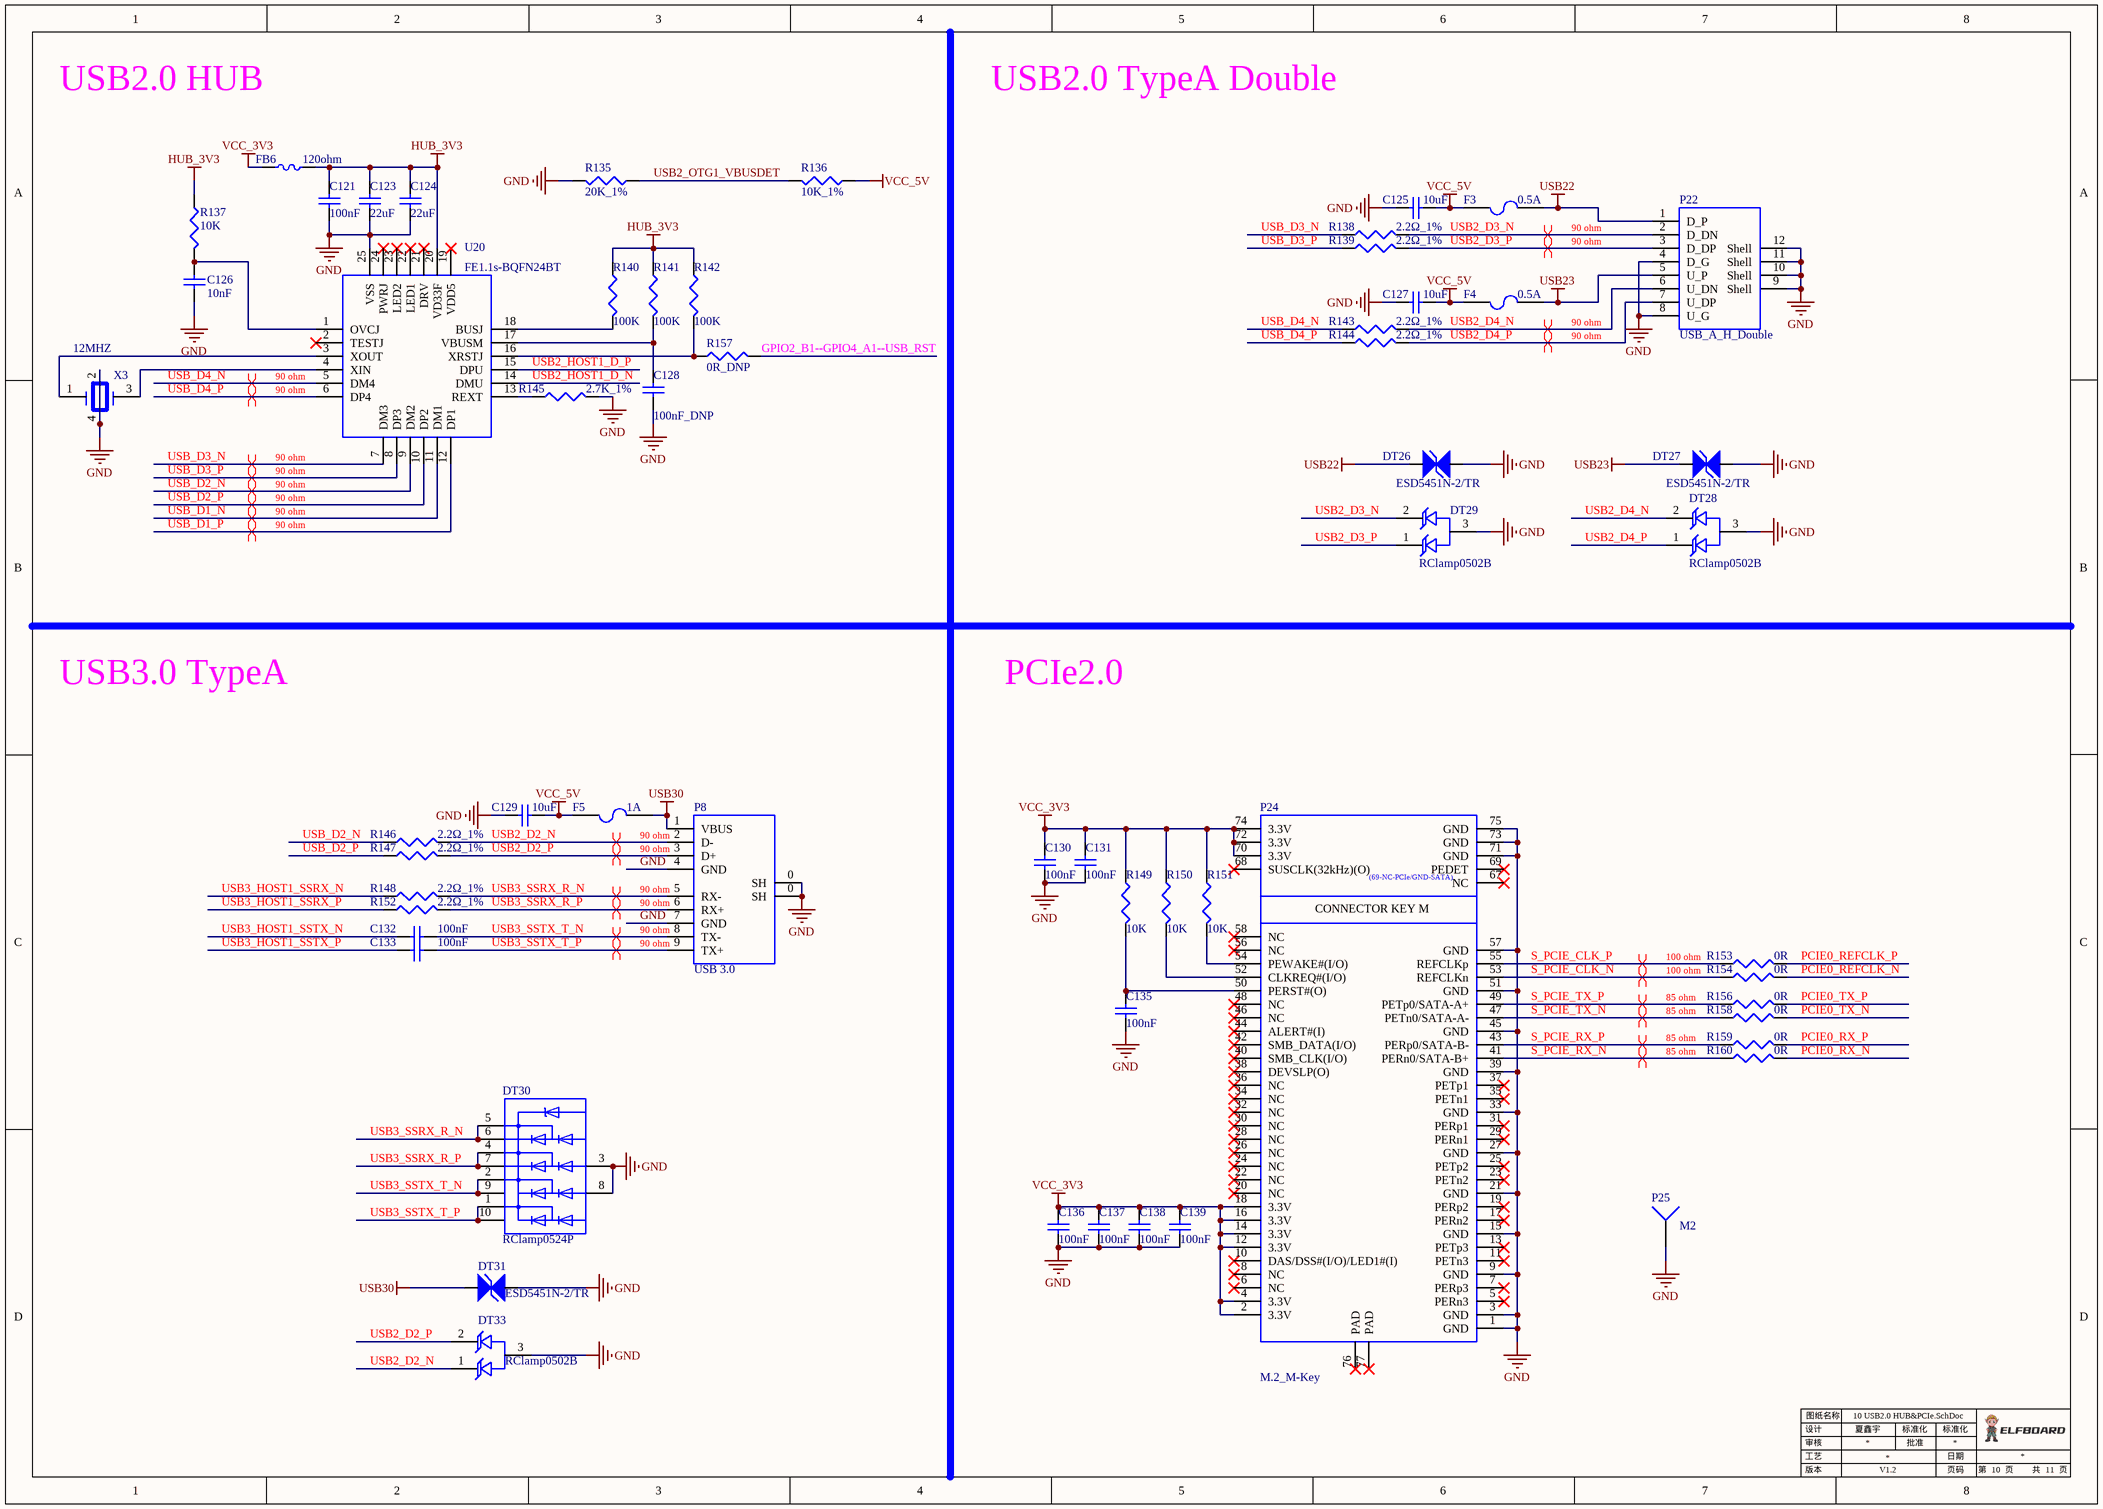
[diagram p12: 10 USB2.0 HUB&PCIe.SchDoc]

### Parts
C121  100nF  [0402C]
C123  22uF  [0603C]
C124  22uF  [0603C]
C125  10uF  [0603C]
C126  10nF  [0402C]
C127  10uF  [0603C]
C128  100nF_DNP  [0402C]
C129  10uF  [0603C]
C130  100nF  [0402C]
C131  100nF  [0402C]
C132  100nF  [0402C]
C133  100nF  [0402C]
C135  100nF  [0402C]
C136  100nF  [0402C]
C137  100nF  [0402C]
C138  100nF  [0402C]
C139  100nF  [0402C]
DT26  ESD5451N-2/TR  [0402TVS]
DT27  ESD5451N-2/TR  [0402TVS]
DT28  RClamp0502B  [SOT_523]
DT29  RClamp0502B  [SOT_523]
DT30  RClamp0524P  [DFN_10L]
DT31  ESD5451N-2/TR  [0402TVS]
DT33  RClamp0502B  [SOT_523]
F3  0.5A  [1210F]
F4  0.5A  [1210F]
F5  1A  [1210F]
FB6  120ohm  [0603L]
P8  USB 3.0  [USB3.0_A-11.78]
P22  USB_A_H_Double  [USB_A_F_W_2]
P24  M.2_M-Key  [M.2_M-Key]
P25  M2  [HOLE3.6-5.6]
R135  20K_1%  [0402R]
R136  10K_1%  [0402R]
R137  10K  [0402R]
R138  2.2Ω_1%  [0402R]
R139  2.2Ω_1%  [0402R]
R140  100K  [0402R]
R141  100K  [0402R]
R142  100K  [0402R]
R143  2.2Ω_1%  [0402R]
R144  2.2Ω_1%  [0402R]
R145  2.7K_1%  [0402R]
R146  2.2Ω_1%  [0402R]
R147  2.2Ω_1%  [0402R]
R148  2.2Ω_1%  [0402R]
R149  10K  [0402R]
R150  10K  [0402R]
R151  10K  [0402R]
R152  2.2Ω_1%  [0402R]
R153  0R  [0402R]
R154  0R  [0402R]
R156  0R  [0402R]
R157  0R_DNP  [0402R]
R158  0R  [0402R]
R159  0R  [0402R]
R160  0R  [0402R]
U20  FE1.1s-BQFN24BT  [QFN24_0.5BSC_4.15*4.15]
X3  12MHZ  [Crystals_3225]

### Nets
GND: C121.1 C123.1 C124.1 C125.1 C126.1 C127.1 C128.1 C129.1 C130.1 C131.1 C135.1 C136.1 C137.1 C138.1 C139.1 DT26.1 DT27.1 DT28.3 DT29.3 DT30.3 DT30.8 DT31.1 DT33.3 P8.0(SH) P8.4(GND) P8.7(GND) P22.4(D_G) P22.8(U_G) P22.9(Shell) P22.10(Shell) P22.11(Shell) P22.12(Shell) P24.1(GND) P24.3(GND) P24.9(GND) P24.15(GND) P24.21(GND) P24.27(GND) P24.33(GND) P24.39(GND) P24.45(GND) P24.51(GND) P24.57(GND) P24.71(GND) P24.73(GND) P24.75(GND) P25.1 R135.2 R145.2 U20.25(VSS) X3.2 X3.4
HUB_3V3: C121.2 C123.2 C124.2 FB6.2 R137.1 R140.1 R141.1 R142.1 U20.20(VD33F)
USB22: DT26.2 F3.1 P22.1(D_P)
USB23: DT27.2 F4.1 P22.5(U_P)
USB30: DT31.2 F5.1 P8.1(VBUS)
VCC_3V3: C130.2 C131.2 C136.2 C137.2 C138.2 C139.2 FB6.1 P24.2(3.3V) P24.4(3.3V) P24.12(3.3V) P24.14(3.3V) P24.16(3.3V) P24.18(3.3V) P24.70(3.3V) P24.72(3.3V) P24.74(3.3V) R149.1 R150.1 R151.1
VCC_5V: C125.2 C127.2 C129.2 F3.2 F4.2 F5.2 R136.1
GPIO2_B1--GPIO4_A1--USB_RST: R157.2
PCIE0_REFCLK_N: R154.2
PCIE0_REFCLK_P: R153.2
PCIE0_RX_N: R160.2
PCIE0_RX_P: R159.2
PCIE0_TX_N: R158.2
PCIE0_TX_P: R156.2
S_PCIE_CLK_N: P24.53(REFCLKn) R154.1
S_PCIE_CLK_P: P24.55(REFCLKp) R153.1
S_PCIE_RX_N: P24.41(PERn0/SATA-B+) R160.1
S_PCIE_RX_P: P24.43(PERp0/SATA-B-) R159.1
S_PCIE_TX_N: P24.47(PETn0/SATA-A-) R158.1
S_PCIE_TX_P: P24.49(PETp0/SATA-A+) R156.1
USB2_D2_N: DT33.1 P8.2(D-) R146.2
USB2_D2_P: DT33.2 P8.3(D+) R147.2
USB2_D3_N: DT29.2 P22.2(D_DN) R138.2
USB2_D3_P: DT29.1 P22.3(D_DP) R139.2
USB2_D4_N: DT28.2 P22.6(U_DN) R143.2
USB2_D4_P: DT28.1 P22.7(U_DP) R144.2
USB2_HOST1_D_N: U20.14(DMU)
USB2_HOST1_D_P: U20.15(DPU)
USB2_OTG1_VBUSDET: R135.1 R136.2
USB3_HOST1_SSRX_N: R148.1
USB3_HOST1_SSRX_P: R152.1
USB3_HOST1_SSTX_N: C132.1
USB3_HOST1_SSTX_P: C133.1
USB3_SSRX_R_N: DT30.5 DT30.6 P8.5(RX-) R148.2
USB3_SSRX_R_P: DT30.4 DT30.7 P8.6(RX+) R152.2
USB3_SSTX_T_N: C132.2 DT30.2 DT30.9 P8.8(TX-)
USB3_SSTX_T_P: C133.2 DT30.1 DT30.10 P8.9(TX+)
USB_D1_N: U20.11(DM1)
USB_D1_P: U20.12(DP1)
USB_D2_N: R146.1 U20.9(DM2)
USB_D2_P: R147.1 U20.10(DP2)
USB_D3_N: R138.1 U20.7(DM3)
USB_D3_P: R139.1 U20.8(DP3)
USB_D4_N: R143.1 U20.5(DM4)
USB_D4_P: R144.1 U20.6(DP4)
NetC126_2: C126.2 R137.2 U20.1(OVCJ)
NetC128_2: C128.2 R141.2 U20.17(VBUSM)
NetC135_2: C135.2 P24.50(PERST#(O)) R149.2
NetP24_52: P24.52(CLKREQ#(I/O)) R150.2
NetP24_54: P24.54(PEWAKE#(I/O)) R151.2
NetR140_2: R140.2 U20.18(BUSJ)
NetR142_2: R142.2 R157.1 U20.16(XRSTJ)
NetR145_1: R145.1 U20.13(REXT)
NetU20_3: U20.3(XOUT) X3.1
NetU20_4: U20.4(XIN) X3.3

Not connected (* = marked no-connect by the designer): P24 5(PERn3)* 6(NC)* 7(PERp3)* 8(NC)* 10(DAS/DSS#(I/O)/LED1#(I))* 11(PETn3)* 13(PETp3)* 17(PERn2)* 19(PERp2)* 20(NC)* 22(NC)* 23(PETn2)* 24(NC)* 25(PETp2)* 26(NC)* 28(NC)* 29(PERn1)* 30(NC)* 31(PERp1)* 32(NC)* 34(NC)* 35(PETn1)* 36(NC)* 37(PETp1)* 38(DEVSLP(O))* 40(SMB_CLK(I/O))* 42(SMB_DATA(I/O))* 44(ALERT#(I))* 46(NC)* 48(NC)* 56(NC)* 58(NC)* 67(NC)* 68(SUSCLK(32kHz)(O))* 69(PEDET)* 76(PAD)* 77(PAD)*; U20 2(TESTJ)* 19(VDD5)* 21(DRV)* 22(LED1)* 23(LED2)* 24(PWRJ)*

### Layout directives
differential pair; differential pair class 100 ohm: S_PCIE_CLK_N, S_PCIE_CLK_P
differential pair; differential pair class 90 ohm: USB2_D2_N, USB2_D2_P, USB2_D3_N, USB2_D3_P, USB2_D4_N, USB2_D4_P, USB3_SSRX_R_N, USB3_SSRX_R_P, USB3_SSTX_T_N, USB3_SSTX_T_P, USB_D1_N, USB_D1_P, USB_D2_N, USB_D2_P, USB_D3_N, USB_D3_P, USB_D4_N, USB_D4_P
differential pair; differential pair class 85 ohm: S_PCIE_RX_N, S_PCIE_RX_P, S_PCIE_TX_N, S_PCIE_TX_P

### Notes on the sheet
- USB2.0 HUB
- USB2.0 TypeA Double
- USB3.0 TypeA
- PCIe2.0
- 设计
- 审核
- 工艺
- 图纸名称
- 夏鑫宇
- 批准
- 标准化
- 日期
- 版本
- 页码
- 第
- 页
- 共
- (in symbol 1120201185) (69-NC-PCIe/GND-SATA); CONNECTOR KEY M

### Library data of the parts
C121 C128 C130 C131 C135-C139 = 1110202039: 序号: 618; 存货名称: 贴装叠层陶瓷电容; 规格型号: 0402,100nF,25V,±10％,X5R; 禁用状态: 否; Published: 8-Jun-2000; LatestRevisionDate: 17-Jul-2002; LatestRevisionNote: Re-released for DXP Platform.; PackageReference: RAD-0.3; Publisher: Altium Limited; PackageDescription: Radial Cap, Thru-Hole; 2 Leads; 0.3 in Pin Spacing; 存货编码: 1110202039
  C121 C130 C131 C135-C139: Value: 100nF
  C128: Value: 100nF_DNP
C123 C124 = 1110203040: 序号: 675; 存货名称: 贴装叠层陶瓷电容; 规格型号: 0603,22uF,6.3V,±20％,X5R; Published: 8-Jun-2000; LatestRevisionDate: 17-Jul-2002; LatestRevisionNote: Re-released for DXP Platform.; PackageReference: RAD-0.3; Publisher: Altium Limited; PackageDescription: Radial Cap, Thru-Hole; 2 Leads; 0.3 in Pin Spacing; Value: 22uF; 存货编码: 1110203040
C125 C127 C129 = 1110203089: 序号: 5456; 存货名称: 贴装叠层陶瓷电容; 规格型号: 0603,10uF,10V,±10％,X5R,0603X106K100NT; 描述: FH/广东风华高新科技股份有限公司; 禁用: #REF!; 近三年购买频次（更新至2023/12/7）: 近三年购买频次,12; Published: 8-Jun-2000; LatestRevisionDate: 17-Jul-2002; LatestRevisionNote: Re-released for DXP Platform.; PackageReference: RAD-0.3; Publisher: Altium Limited; PackageDescription: Radial Cap, Thru-Hole; 2 Leads; 0.3 in Pin Spacing; Value: 10uF; 存货编码: 1110203089; 最近一次购买记录(更新至20231207）: 2023/11/8; 料号建立日期: 2023/6/9
C126 = 1110202014: 序号: 593; 存货名称: 贴装叠层陶瓷电容; 规格型号: 0402,10nF,50V,±10％,X7R; 禁用状态: 否; Published: 8-Jun-2000; LatestRevisionDate: 17-Jul-2002; LatestRevisionNote: Re-released for DXP Platform.; PackageReference: RAD-0.3; Publisher: Altium Limited; PackageDescription: Radial Cap, Thru-Hole; 2 Leads; 0.3 in Pin Spacing; Value: 10nF; 存货编码: 1110202014
C132 C133 = 1110202001: 序号: 570; 存货名称: 贴装叠层陶瓷电容; 规格型号: 0402,100nF,16V,±10％,X7R; 禁用状态: 否; Published: 8-Jun-2000; LatestRevisionDate: 17-Jul-2002; LatestRevisionNote: Re-released for DXP Platform.; PackageReference: RAD-0.3; Publisher: Altium Limited; PackageDescription: Radial Cap, Thru-Hole; 2 Leads; 0.3 in Pin Spacing; Value: 100nF; 存货编码: 1110202001
DT26 DT27 DT31 = 1110503036: 存货名称: TVS管; 规格型号: ESD5451N-2/TR,DFN1006-2L; 禁用状态: 否; Value: ESD5451N-2/TR; 存货编码: 1110503036
DT28 DT29 = 1110503016: 序号: 2598; 存货名称: TVS管; 规格型号: RC1amp0502B SOT-523; 主计量单位名称: 只; 安全库存: 2084.00; 旧编码: 010603010; Value: RClamp0502B; 存货编码: 1110503016; 启用日期: 2013/1/1
DT30 = 1110405308: 存货名称: 常规IC; 规格型号: RClamp0524PATCT,DFN-10L; 描述栏信息: 替代1110405144; 禁用状态: 否; 存货编码: 1110405308; value: RClamp0524P
DT33 = 1110503016: 序号: 2598; 存货名称: TVS管; 规格型号: RC1amp0502B,SOT-523; 主计量单位名称: 只; 安全库存: 1767; 旧编码: 010603010; 旧规格型号: RC1amp0502B SOT-523; Value: RClamp0502B; 存货编码: 1110503016
F3 F4 = 1110305006: 序号: 1038; 存货名称: 自恢复保险; 规格型号: 1210,0.5A; 禁用: #REF!; 近三年购买频次（更新至2023/12/7）: 近三年购买频次,37; Published: 8-Jun-2000; LatestRevisionDate: 17-Jul-2002; LatestRevisionNote: Re-released for DXP Platform.; PackageReference: PIN-W2/E2.8; Publisher: Altium Limited; PackageDescription: Thru-Hole; 2 Leads; Value: 0.5A; 存货编码: 1110305006; 最近一次购买记录(更新至20231207）: 2023/12/5; 料号建立日期: 2019/7/2
F5 = 1110305004: 序号: 1036; 存货名称: 自恢复保险; 规格型号: 1210,1A; 禁用: #REF!; 近三年购买频次（更新至2023/12/7）: 近三年购买频次,4; Published: 8-Jun-2000; LatestRevisionDate: 17-Jul-2002; LatestRevisionNote: Re-released for DXP Platform.; PackageReference: PIN-W2/E2.8; Publisher: Altium Limited; PackageDescription: Thru-Hole; 2 Leads; Value: 1A; 存货编码: 1110305004; 最近一次购买记录(更新至20231207）: 2023/12/5; 料号建立日期: 2019/7/2
FB6 = 1110304011: 序号: 1028; 存货名称: 磁珠; 规格型号: 0603,120ohm,500mA,WLCB1608-120Ω; VALUE: 120ohm; 存货编码: 1110304011
P8 = 1120202208: 存货名称: 插装USB座; 规格型号: USB3.0,母座,单层,横卧,富士康; 禁用: 否; Value: USB 3.0; 存货编码: 1120202208
P22 = 1120202032: 序号: 1365; 存货名称: 插装USB座; 规格型号: USB2.0,A型,母座,双层,横卧; 存货编码: 1120202032; Value: USB_A_H_Double
P24 = 1120201185: 存货名称: M.2插槽; 规格型号: 0.5PITCH,M.2, H4.2,KEY M; Value: M.2_M-Key; 存货编码: 1120201185
P25 = 1150303024: 序号: 3308; 存货名称: 贴片螺母; 规格型号: M2mm,长2mm; 禁用: #REF!; 近三年购买频次（更新至2023/12/7）: 近三年购买频次,73; LatestRevisionDate: 17-Jul-2002; LatestRevisionNote: Re-released for DXP Platform.; Publisher: Altium Limited; Value: M2; 存货编码: 1150303024; 最近一次购买记录(更新至20231207）: 2023/12/5; 料号建立日期: 2019/7/2
R135 = 1110102074: 序号: 94; 存货名称: 贴装电阻; 规格型号: 0402,20K,±1％; 禁用状态: 否; Value: 20K_1%; 存货编码: 1110102074
R136 = 1110102037: 序号: 57; 存货名称: 贴装电阻; 规格型号: 0402,10K,±1％; 禁用状态: 否; Value: 10K_1%; 存货编码: 1110102037
R137 R149-R151 = 1110102007: 序号: 27; 存货名称: 贴装电阻; 规格型号: 0402,10K,±5％; 禁用状态: 否; Value: 10K; 存货编码: 1110102007
R138 R139 R143 R144 R146-R148 R152 = 1110102176: 存货名称: 贴装电阻; 规格型号: 0402,2.2Ω,±1％; 禁用状态: 否; Value: 2.2Ω_1%; 存货编码: 1110102176
R140-R142 = 1110102004: 序号: 24; 存货名称: 贴装电阻; 规格型号: 0402,100K,±5％; 禁用状态: 否; Value: 100K; 存货编码: 1110102004
R145 = 1110102192: 序号: 4302; 存货名称: 贴装电阻; 规格型号: 0402,2.7K,±1%; 禁用状态: 否; Value: 2.7K_1%; 存货编码: 1110102192
R153 R154 R156 R158-R160 = 1110102001: 序号: 10; 存货名称: 贴装电阻; 规格型号: 0402,0Ω,±5％; Value: 0R; 存货编码: 1110102001
R157 = 1110102001: 序号: 21; 存货名称: 贴装电阻; 规格型号: 0402,0Ω,±5％; 禁用: 否; 近三年购买频次（更新至2023/12/7）: 近三年购买频次,65; Value: 0R_DNP; 存货编码: 1110102001; 最近一次购买记录(更新至20231207）: 2023/9/25; 料号建立日期: 2019/7/2
U20 = 1110405348: 存货名称: 常规IC; 规格型号: FE1.1s-BQFN24BT,QFN-24,工业级; Value: FE1.1s-BQFN24BT; 存货编码: 1110405348
X3 = 1110601032: 序号: 3377; 存货名称: 贴装晶振; 规格型号: 无源,12MHZ,4P,3.2*2.5mm,±20ppm,20pf; Value: 12MHZ; 存货编码: 1110601032

## Sheet 11 WIFI&BT&GPIO.SchDoc
size A3; Revision: V1.2; SheetNumber: 11; SheetTotal: 11
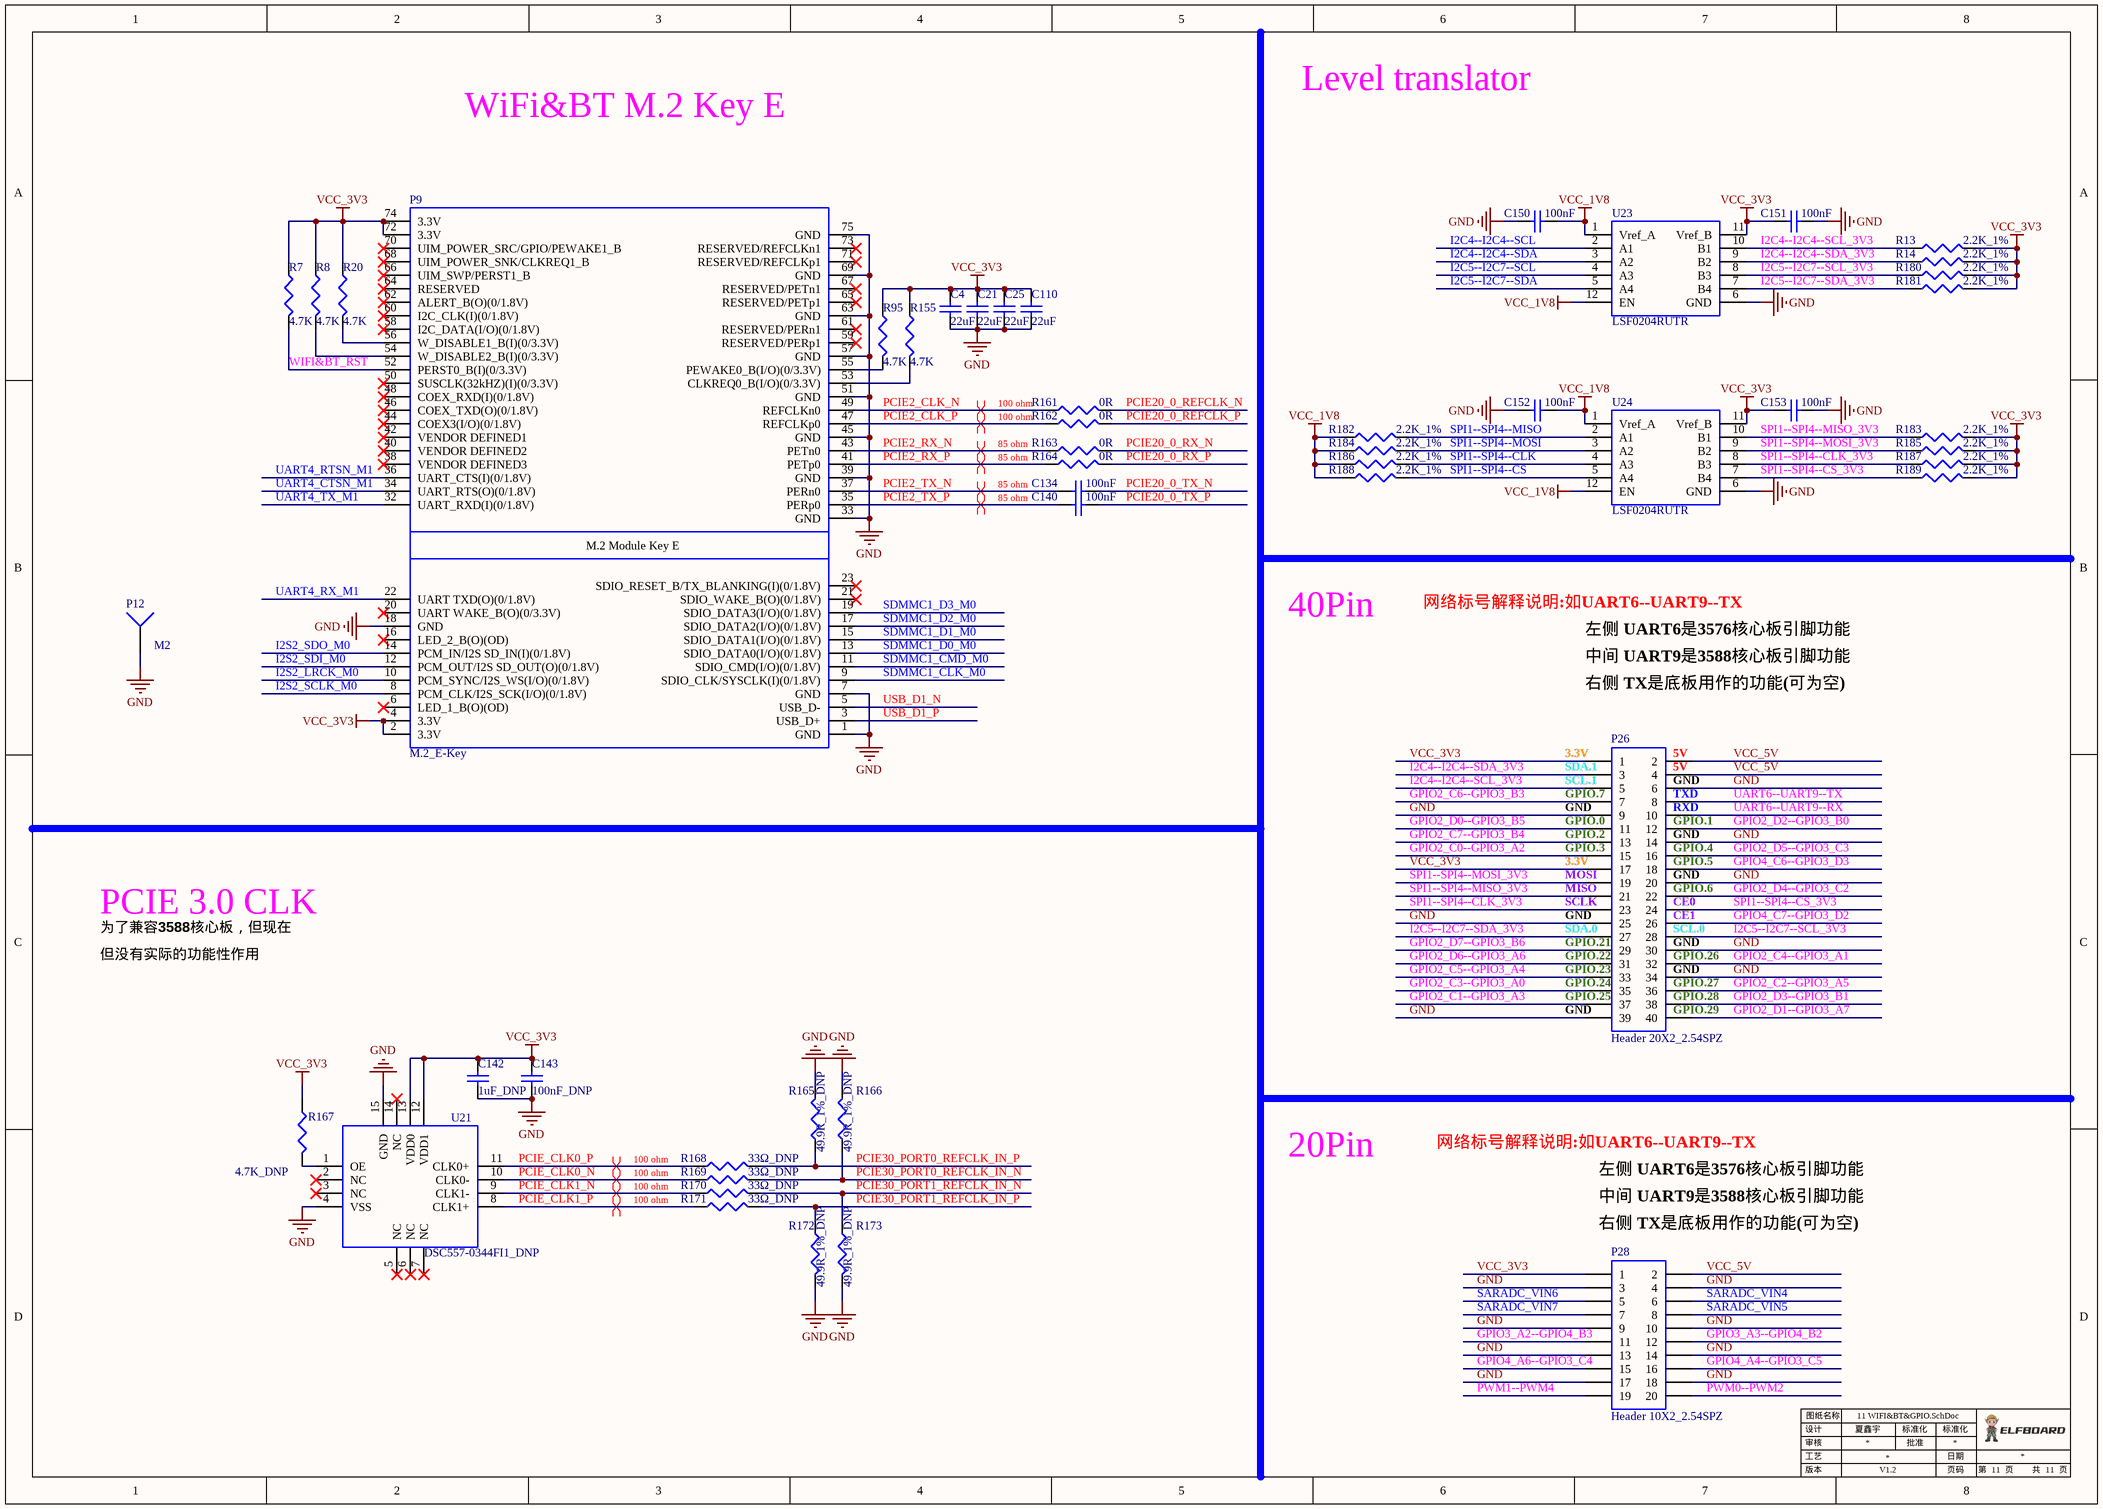
[diagram p13: 11 WIFI&BT&GPIO.SchDoc]

### Parts
C4  22uF  [0603C]
C21  22uF  [0603C]
C25  22uF  [0603C]
C110  22uF  [0603C]
C134  100nF  [0402C]
C140  100nF  [0402C]
C142  1uF_DNP  [0402C]
C143  100nF_DNP  [0402C]
C150  100nF  [0402C]
C151  100nF  [0402C]
C152  100nF  [0402C]
C153  100nF  [0402C]
P9  M.2_E-Key  [M.2_E-Key]
P12  M2  [HOLE3.6-5.6]
P26  Header 20X2_2.54SPZ  [HEADER2*20_2.54_SPZ]
P28  Header 10X2_2.54SPZ  [HEADER2*10_2.54_SPZ]
R7  4.7K  [0402R]
R8  4.7K  [0402R]
R13  2.2K_1%  [0402R]
R14  2.2K_1%  [0402R]
R20  4.7K  [0402R]
R95  4.7K  [0402R]
R155  4.7K  [0402R]
R161  0R  [0402R]
R162  0R  [0402R]
R163  0R  [0402R]
R164  0R  [0402R]
R165  49.9R_1%_DNP  [0201R]
R166  49.9R_1%_DNP  [0201R]
R167  4.7K_DNP  [0402R]
R168  33Ω_DNP  [0201R]
R169  33Ω_DNP  [0201R]
R170  33Ω_DNP  [0201R]
R171  33Ω_DNP  [0201R]
R172  49.9R_1%_DNP  [0201R]
R173  49.9R_1%_DNP  [0201R]
R180  2.2K_1%  [0402R]
R181  2.2K_1%  [0402R]
R182  2.2K_1%  [0402R]
R183  2.2K_1%  [0402R]
R184  2.2K_1%  [0402R]
R185  2.2K_1%  [0402R]
R186  2.2K_1%  [0402R]
R187  2.2K_1%  [0402R]
R188  2.2K_1%  [0402R]
R189  2.2K_1%  [0402R]
U21  DSC557-0344FI1_DNP  [QFN14_2.5*3.2]
U23  LSF0204RUTR  [UQFN]
U24  LSF0204RUTR  [UQFN]

### Nets
GND: C4.1 C21.1 C25.1 C110.1 C142.1 C143.1 C150.1 C151.1 C152.1 C153.1 P9.1(GND) P9.7(GND) P9.18(GND) P9.33(GND) P9.39(GND) P9.45(GND) P9.51(GND) P9.57(GND) P9.63(GND) P9.69(GND) P9.75(GND) P12.1 P26.6 P26.9 P26.14 P26.20 P26.25 P26.30 P26.34 P26.39 P28.3 P28.4 P28.9 P28.10 P28.13 P28.14 P28.17 P28.18 R165.2 R166.2 R172.2 R173.2 U21.4(VSS) U21.15(GND) U23.6(GND) U24.6(GND)
VCC_1V8: C150.2 C152.2 R182.1 R184.1 R186.1 R188.1 U23.1(Vref_A) U23.12(EN) U24.1(Vref_A) U24.12(EN)
VCC_3V3: C4.2 C21.2 C25.2 C110.2 C142.2 C143.2 C151.2 C153.2 P9.2(3.3V) P9.4(3.3V) P9.72(3.3V) P9.74(3.3V) P26.1 P26.17 P28.1 R7.1 R8.1 R13.2 R14.2 R20.1 R95.1 R155.1 R167.1 R180.2 R181.2 R183.2 R185.2 R187.2 R189.2 U21.12(VDD1) U21.13(VDD0) U23.11(Vref_B) U24.11(Vref_B)
VCC_5V: P26.2 P26.4 P28.2
GPIO2_C0--GPIO3_A2: P26.15
GPIO2_C1--GPIO3_A3: P26.37
GPIO2_C2--GPIO3_A5: P26.36
GPIO2_C3--GPIO3_A0: P26.35
GPIO2_C4--GPIO3_A1: P26.32
GPIO2_C5--GPIO3_A4: P26.33
GPIO2_C6--GPIO3_B3: P26.7
GPIO2_C7--GPIO3_B4: P26.13
GPIO2_D0--GPIO3_B5: P26.11
GPIO2_D1--GPIO3_A7: P26.40
GPIO2_D2--GPIO3_B0: P26.12
GPIO2_D3--GPIO3_B1: P26.38
GPIO2_D4--GPIO3_C2: P26.22
GPIO2_D5--GPIO3_C3: P26.16
GPIO2_D6--GPIO3_A6: P26.31
GPIO2_D7--GPIO3_B6: P26.29
GPIO3_A2--GPIO4_B3: P28.11
GPIO3_A3--GPIO4_B2: P28.12
GPIO4_A4--GPIO3_C5: P28.16
GPIO4_A6--GPIO3_C4: P28.15
GPIO4_C6--GPIO3_D3: P26.18
GPIO4_C7--GPIO3_D2: P26.26
I2C4--I2C4--SCL: U23.2(A1)
I2C4--I2C4--SCL_3V3: P26.5 R13.1 U23.10(B1)
I2C4--I2C4--SDA: U23.3(A2)
I2C4--I2C4--SDA_3V3: P26.3 R14.1 U23.9(B2)
I2C5--I2C7--SCL: U23.4(A3)
I2C5--I2C7--SCL_3V3: P26.28 R180.1 U23.8(B3)
I2C5--I2C7--SDA: U23.5(A4)
I2C5--I2C7--SDA_3V3: P26.27 R181.1 U23.7(B4)
I2S2_LRCK_M0: P9.10(PCM_SYNC/I2S_WS(I/O)(0/1.8V))
I2S2_SCLK_M0: P9.8(PCM_CLK/I2S_SCK(I/O)(0/1.8V))
I2S2_SDI_M0: P9.12(PCM_OUT/I2S_SD_OUT(O)(0/1.8V))
I2S2_SDO_M0: P9.14(PCM_IN/I2S_SD_IN(I)(0/1.8V))
PCIE2_CLK_N: P9.49(REFCLKn0) R161.1
PCIE2_CLK_P: P9.47(REFCLKp0) R162.1
PCIE2_RX_N: P9.43(PETn0) R163.1
PCIE2_RX_P: P9.41(PETp0) R164.1
PCIE2_TX_N: C134.1 P9.37(PERn0)
PCIE2_TX_P: C140.1 P9.35(PERp0)
PCIE20_0_REFCLK_N: R161.2
PCIE20_0_REFCLK_P: R162.2
PCIE20_0_RX_N: R163.2
PCIE20_0_RX_P: R164.2
PCIE20_0_TX_N: C134.2
PCIE20_0_TX_P: C140.2
PCIE30_PORT0_REFCLK_IN_N: R166.1 R169.2
PCIE30_PORT0_REFCLK_IN_P: R165.1 R168.2
PCIE30_PORT1_REFCLK_IN_N: R170.2 R173.1
PCIE30_PORT1_REFCLK_IN_P: R171.2 R172.1
PCIE_CLK0_N: R169.1 U21.10(CLK0-)
PCIE_CLK0_P: R168.1 U21.11(CLK0+)
PCIE_CLK1_N: R170.1 U21.9(CLK1-)
PCIE_CLK1_P: R171.1 U21.8(CLK1+)
PWM0--PWM2: P28.20
PWM1--PWM4: P28.19
SARADC_VIN4: P28.6
SARADC_VIN5: P28.8
SARADC_VIN6: P28.5
SARADC_VIN7: P28.7
SDMMC1_CLK_M0: P9.9(SDIO_CLK/SYSCLK(I)(0/1.8V))
SDMMC1_CMD_M0: P9.11(SDIO_CMD(I/O)(0/1.8V))
SDMMC1_D0_M0: P9.13(SDIO_DATA0(I/O)(0/1.8V))
SDMMC1_D1_M0: P9.15(SDIO_DATA1(I/O)(0/1.8V))
SDMMC1_D2_M0: P9.17(SDIO_DATA2(I/O)(0/1.8V))
SDMMC1_D3_M0: P9.19(SDIO_DATA3(I/O)(0/1.8V))
SPI1--SPI4--CLK: R186.2 U24.4(A3)
SPI1--SPI4--CLK_3V3: P26.23 R187.1 U24.8(B3)
SPI1--SPI4--CS: R188.2 U24.5(A4)
SPI1--SPI4--CS_3V3: P26.24 R189.1 U24.7(B4)
SPI1--SPI4--MISO: R182.2 U24.2(A1)
SPI1--SPI4--MISO_3V3: P26.21 R183.1 U24.10(B1)
SPI1--SPI4--MOSI: R184.2 U24.3(A2)
SPI1--SPI4--MOSI_3V3: P26.19 R185.1 U24.9(B2)
UART4_CTSN_M1: P9.34(UART_RTS(O)(0/1.8V))
UART4_RTSN_M1: P9.36(UART_CTS(I)(0/1.8V))
UART4_RX_M1: P9.22(UART_TXD(O)(0/1.8V))
UART4_TX_M1: P9.32(UART_RXD(I)(0/1.8V))
UART6--UART9--RX: P26.10
UART6--UART9--TX: P26.8
USB_D1_N: P9.5(USB_D-)
USB_D1_P: P9.3(USB_D+)
WIFI&BT_RST: P9.52(PERST0_B(I)(0/3.3V)) R7.2
NetP9_53: P9.53(CLKREQ0_B(I/O)(0/3.3V)) R155.2
NetP9_54: P9.54(W_DISABLE2_B(I)(0/3.3V)) R8.2
NetP9_55: P9.55(PEWAKE0_B(I/O)(0/3.3V)) R95.2
NetP9_56: P9.56(W_DISABLE1_B(I)(0/3.3V)) R20.2
NetR167_2: R167.2 U21.1(OE)

Not connected (* = marked no-connect by the designer): P9 6(LED_1_B(O)(OD))* 16(LED_2_B(O)(OD))* 20(UART_WAKE_B(O)(0/3.3V))* 21(SDIO_WAKE_B(O)(0/1.8V))* 23(SDIO_RESET_B/TX_BLANKING(I)(0/1.8V))* 38(VENDOR_DEFINED3)* 40(VENDOR_DEFINED2)* 42(VENDOR_DEFINED1)* 44(COEX3(I/O)(0/1.8V))* 46(COEX_TXD(O)(0/1.8V))* 48(COEX_RXD(I)(0/1.8V))* 50(SUSCLK(32kHZ)(I)(0/3.3V))* 58(I2C_DATA(I/O)(0/1.8V))* 59(RESERVED/PERp1)* 60(I2C_CLK(I)(0/1.8V))* 61(RESERVED/PERn1)* 62(ALERT_B(O)(0/1.8V))* 64(RESERVED)* 65(RESERVED/PETp1)* 66(UIM_SWP/PERST1_B)* 67(RESERVED/PETn1)* 68(UIM_POWER_SNK/CLKREQ1_B)* 70(UIM_POWER_SRC/GPIO/PEWAKE1_B)* 71(RESERVED/REFCLKp1)* 73(RESERVED/REFCLKn1)*; U21 2(NC)* 3(NC)* 5(NC)* 6(NC)* 7(NC)* 14(NC)*

### Layout directives
differential pair; differential pair class 100 ohm: PCIE2_CLK_N, PCIE2_CLK_P, PCIE_CLK0_N, PCIE_CLK0_P, PCIE_CLK1_N, PCIE_CLK1_P
differential pair; differential pair class 85 ohm: PCIE2_RX_N, PCIE2_RX_P, PCIE2_TX_N, PCIE2_TX_P

### Notes on the sheet
- Level translator
- WiFi&BT M.2 Key E
- 40Pin
- 网络标号解释说明:如UART6--UART9--TX
- 左侧 UART6是3576核心板引脚功能
- 中间 UART9是3588核心板引脚功能
- 右侧 TX是底板用作的功能(可为空)
- (near P26) 3.3V
- (near P26) SDA.1
- (near P26) SCL.1
- (near P26) 5V
- (near P26) GND
- (near P26) GPIO.7
- (near P26) GPIO.0
- (near P26) GPIO.2
- (near P26) GPIO.3
- (near P26) TXD
- (near P26) RXD
- (near P26) GPIO.1
- (near P26) GPIO.4
- PCIE 3.0 CLK
- (near P26) MOSI
- (near P26) MISO
- (near P26) SCLK
- (near P26) GPIO.5
- (near P26) GPIO.6
- (near P26) CE0
- (near P26) CE1
- 为了兼容3588核心板，但现在
- 但没有实际的功能性作用
- (near P26) SDA.0
- (near P26) GPIO.21
- (near P26) GPIO.22
- (near P26) GPIO.23
- (near P26) GPIO.24
- (near P26) SCL.0
- (near P26) GPIO.26
- (near P26) GPIO.27
- (near P26) GPIO.25
- (near P26) GPIO.28
- (near P26) GPIO.29
- 20Pin
- (near P28) 右侧 TX是底板用作的功能(可为空)
- 设计
- 审核
- 工艺
- 图纸名称
- 夏鑫宇
- 批准
- 标准化
- 日期
- 版本
- 页码
- 第
- 页
- 共
- (in symbol 1120201188) M.2 Module Key E

### Library data of the parts
C4 C21 C25 C110 = 1110203040: 序号: 675; 存货名称: 贴装叠层陶瓷电容; 规格型号: 0603,22uF,6.3V,±20％,X5R; 主计量单位名称: 个; 安全库存: 678357; 旧编码: 010202048; 旧规格型号: 0603 22uF 6.3V ±20％ X5R; Published: 8-Jun-2000; LatestRevisionDate: 17-Jul-2002; LatestRevisionNote: Re-released for DXP Platform.; PackageReference: RAD-0.3; Publisher: Altium Limited; PackageDescription: Radial Cap, Thru-Hole; 2 Leads; 0.3 in Pin Spacing; Value: 22uF; 存货编码: 1110203040
C134 C140 C143 = 1110202039: as C95 on sheet 09 Audio; Published: 8-Jun-2000; LatestRevisionDate: 17-Jul-2002; LatestRevisionNote: Re-released for DXP Platform.; PackageReference: RAD-0.3; Publisher: Altium Limited; PackageDescription: Radial Cap, Thru-Hole; 2 Leads; 0.3 in Pin Spacing; 存货编码: 1110202039
  C134 C140: Value: 100nF
  C143: Value: 100nF_DNP
C142 = 1110202021: as C105 on sheet 09 Audio; Published: 8-Jun-2000; LatestRevisionDate: 17-Jul-2002; LatestRevisionNote: Re-released for DXP Platform.; PackageReference: RAD-0.3; Publisher: Altium Limited; PackageDescription: Radial Cap, Thru-Hole; 2 Leads; 0.3 in Pin Spacing; Value: 1uF_DNP; 存货编码: 1110202021
C150-C153 = 1110202001: 序号: 570; 存货名称: 贴装叠层陶瓷电容; 规格型号: 0402,100nF,16V,±10％,X7R; 主计量单位名称: 个; 安全库存: 2580445; 旧编码: 010201001; 旧规格型号: 0402 100nF 16V ±10％ X7R; Published: 8-Jun-2000; LatestRevisionDate: 17-Jul-2002; LatestRevisionNote: Re-released for DXP Platform.; PackageReference: RAD-0.3; Publisher: Altium Limited; PackageDescription: Radial Cap, Thru-Hole; 2 Leads; 0.3 in Pin Spacing; Value: 100nF; 存货编码: 1110202001
P9 = 1120201188: 存货名称: 插槽; 规格型号: M.2,0.5PITCH, H3,KEY E; 存货编码: 1120201188; Value: M.2_E-Key
P12 = 1150303066: 存货名称: 贴片螺母; 规格型号: M2mm,长1.5mm; LatestRevisionDate: 17-Jul-2002; LatestRevisionNote: Re-released for DXP Platform.; Publisher: Altium Limited; Value: M2; 存货编码: 1150303066
P26 = 1120201351: 存货名称: 插装插针; 规格型号: 双排,2*20P,2.54mm,S,镀金,塑胶是彩色,兼容树莓派; 禁用: 否; LatestRevisionDate: 17-Jul-2002; LatestRevisionNote: Re-released for DXP Platform.; Publisher: Altium Limited; Value: Header 20X2_2.54SPZ; 存货编码: 1120201351
P28 = 1120201363: 存货名称: 插装插针; 规格型号: 双排,2*10P,2.54mm,S,镀金; 禁用: 否; LatestRevisionDate: 17-Jul-2002; LatestRevisionNote: Re-released for DXP Platform.; Publisher: Altium Limited; Value: Header 10X2_2.54SPZ; 存货编码: 1120201363
R7 R8 R20 R95 R155 R167 = 1110102003: 序号: 23; 存货名称: 贴装电阻; 规格型号: 0402,4.7K,±5％; 禁用: #REF!; 近三年购买频次（更新至2023/12/7）: 近三年购买频次,59; 存货编码: 1110102003; 最近一次购买记录(更新至20231207）: 2023/11/21; 料号建立日期: 2019/7/2
  R7 R8 R20 R95 R155: Value: 4.7K
  R167: Value: 4.7K_DNP
R13 R14 R180-R189 = 1110102038: 序号: 58; 存货名称: 贴装电阻; 规格型号: 0402,2.2K,±1％; 禁用: 否; 近三年购买频次（更新至2023/12/7）: 近三年购买频次,47; Value: 2.2K_1%; 存货编码: 1110102038; 最近一次购买记录(更新至20231207）: 2023/11/28; 料号建立日期: 2019/7/2
R161-R164 = 1110102001: 序号: 10; 存货名称: 贴装电阻; 规格型号: 0402,0Ω,±5％; Value: 0R; 存货编码: 1110102001
R165 R166 R172 R173 = 1110101027: 存货名称: 贴装电阻; 规格型号: 0201,49.9Ω,±1％; Value: 49.9R_1%_DNP; 存货编码: 1110101027
R168-R171 = 1110101032: 序号: 4737; 存货名称: 贴装电阻; 规格型号: 0201,33Ω,±5%; 禁用: 否; 近三年购买频次（更新至2023/12/7）: 近三年购买频次,3; Value: 33Ω_DNP; 存货编码: 1110101032; 最近一次购买记录(更新至20231207）: 2023/9/6; 料号建立日期: 2022/9/2
U21 = 1110405372: 存货名称: 常规IC; 规格型号: DSC557-0344FL1,14-Lead 2.5 mm x 3.2 mm QFN,–40°C to +105°C; 序号: 4269; 描述: Microchip/美国微芯; 禁用: 否; 近三年购买频次（更新至2023/12/7）: 近三年购买频次,11; Value: DSC557-0344FI1_DNP; 存货编码: 1110405372; 最近一次购买记录(更新至20231207）: 2023/10/17; 料号建立日期: 2022/1/11
U23 U24 = 1110405038: 序号: 1916; 存货名称: 常规IC; 主计量单位名称: 片; 安全库存: 2609; 旧编码: 010503063; Value: LSF0204RUTR; 存货编码: 1110405038; 规格型号: LSF0204RUTR; 旧规格型号: LSF0204RUTR